# Altium project Zybo_Z7.PrjPcb (part 1 of 3)
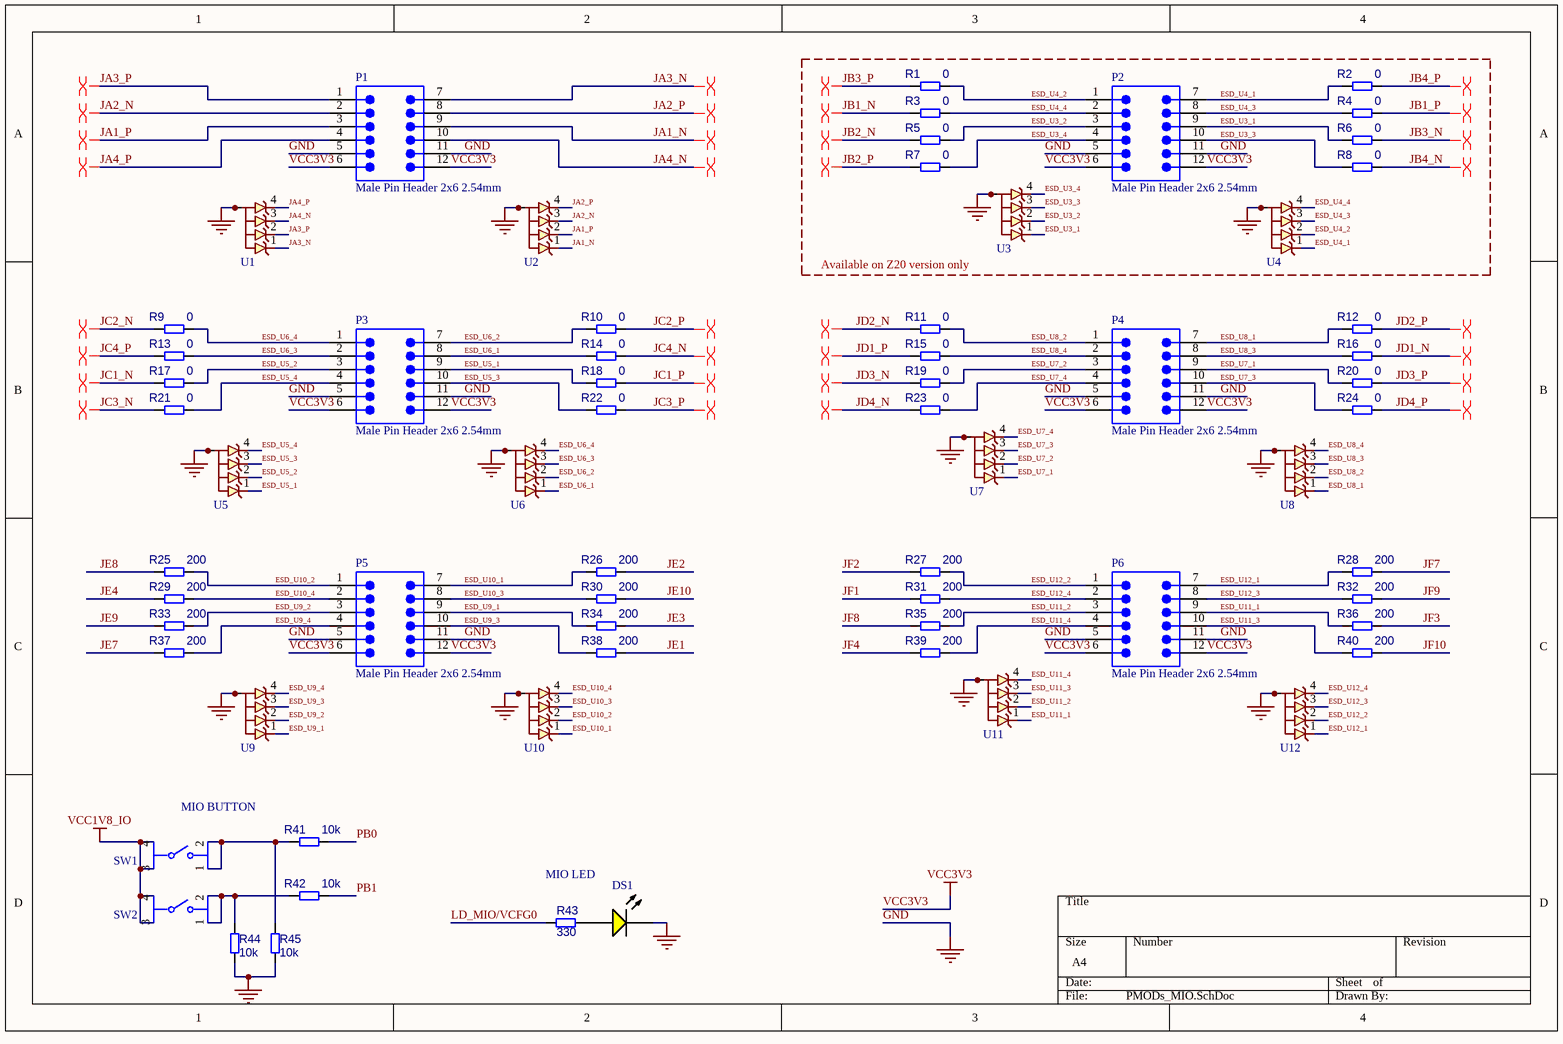
[diagram p0: PMODs_MIO.SchDoc]
13 sheets, 658 parts. Net scope: global (net labels, ports and power ports of the same name join across sheets).
Board file: Zybo_Z7_Pcb.PcbDoc
Sheets:
  PMODs_MIO.SchDoc
  MIPI_General_IO.SchDoc
  Ethernet_and_SD_Card.SchDoc
  Audio_Codec.SchDoc
  HDMI_Source.SchDoc
  HDMI_Sink.SchDoc
  USB_OTG.SchDoc
  FPGA_Config_Flash.SchDoc
  DDR_and_MIO_Banks.SchDoc
  FPGA_Banks_and_Filters.SchDoc
  FPGA_Power.SchDoc
  DDR3_Memory.SchDoc
  Power_Regulation.SchDoc

## Sheet PMODs_MIO.SchDoc
size A4; SheetNumber: 1; SheetTotal: 13

### Parts
DS1  19-217/Y5C-AM1N1VY/3T  [EVRL-0603-2_V]  (value not drawn)
P1  Male Pin Header 2x6 2.54mm  [Copy of Copy of Copy of 3M-2340-6111TG_V]
P2  Male Pin Header 2x6 2.54mm  [Copy of Copy of Copy of 3M-2340-6111TG_V]
P3  Male Pin Header 2x6 2.54mm  [Copy of Copy of Copy of 3M-2340-6111TG_V]
P4  Male Pin Header 2x6 2.54mm  [Copy of Copy of Copy of 3M-2340-6111TG_V]
P5  Male Pin Header 2x6 2.54mm  [Copy of Copy of Copy of 3M-2340-6111TG_V]
P6  Male Pin Header 2x6 2.54mm  [Copy of Copy of Copy of 3M-2340-6111TG_V]
R1  0  [R_0402]
R2  0  [R_0402]
R3  0  [R_0402]
R4  0  [R_0402]
R5  0  [R_0402]
R6  0  [R_0402]
R7  0  [R_0402]
R8  0  [R_0402]
R9  0  [R_0402]
R10  0  [R_0402]
R11  0  [R_0402]
R12  0  [R_0402]
R13  0  [R_0402]
R14  0  [R_0402]
R15  0  [R_0402]
R16  0  [R_0402]
R17  0  [R_0402]
R18  0  [R_0402]
R19  0  [R_0402]
R20  0  [R_0402]
R21  0  [R_0402]
R22  0  [R_0402]
R23  0  [R_0402]
R24  0  [R_0402]
R25  200  [R_0402]
R26  200  [R_0402]
R27  200  [R_0402]
R28  200  [R_0402]
R29  200  [R_0402]
R30  200  [R_0402]
R31  200  [R_0402]
R32  200  [R_0402]
R33  200  [R_0402]
R34  200  [R_0402]
R35  200  [R_0402]
R36  200  [R_0402]
R37  200  [R_0402]
R38  200  [R_0402]
R39  200  [R_0402]
R40  200  [R_0402]
R41  10k  [R_0402]
R42  10k  [R_0402]
R43  330  [R_0402]
R44  10k  [R_0402]
R45  10k  [R_0402]
SW1  1301.9316.24  [FP-1301_9316_24-MFG]  (value not drawn)
SW2  1301.9316.24  [FP-1301_9316_24-MFG]  (value not drawn)
U1  TVS0701DRBR  [FP-DRB0008A-MFG]  (value not drawn)
U2  TVS0701DRBR  [FP-DRB0008A-MFG]  (value not drawn)
U3  TVS0701DRBR  [FP-DRB0008A-MFG]  (value not drawn)
U4  TVS0701DRBR  [FP-DRB0008A-MFG]  (value not drawn)
U5  TVS0701DRBR  [FP-DRB0008A-MFG]  (value not drawn)
U6  TVS0701DRBR  [FP-DRB0008A-MFG]  (value not drawn)
U7  TVS0701DRBR  [FP-DRB0008A-MFG]  (value not drawn)
U8  TVS0701DRBR  [FP-DRB0008A-MFG]  (value not drawn)
U9  TVS0701DRBR  [FP-DRB0008A-MFG]  (value not drawn)
U10  TVS0701DRBR  [FP-DRB0008A-MFG]  (value not drawn)
U11  TVS0701DRBR  [FP-DRB0008A-MFG]  (value not drawn)
U12  TVS0701DRBR  [FP-DRB0008A-MFG]  (value not drawn)

### Blocks framed on the sheet
Available on Z20 version only: P2 R1-R8 U3 U4

### Nets
GND: DS1.2(K) P1.5 P1.11 P2.5 P2.11 P3.5 P3.11 P4.5 P4.11 P5.5 P5.11 P6.5 P6.11 R44.1 R45.1 U1.5(GND) U1.6(GND) U1.7(GND) U1.8(GND) U1.9(Thermal_Pad) U2.5(GND) U2.6(GND) U2.7(GND) U2.8(GND) U2.9(Thermal_Pad) U3.5(GND) U3.6(GND) U3.7(GND) U3.8(GND) U3.9(Thermal_Pad) U4.5(GND) U4.6(GND) U4.7(GND) U4.8(GND) U4.9(Thermal_Pad) U5.5(GND) U5.6(GND) U5.7(GND) U5.8(GND) U5.9(Thermal_Pad) U6.5(GND) U6.6(GND) U6.7(GND) U6.8(GND) U6.9(Thermal_Pad) U7.5(GND) U7.6(GND) U7.7(GND) U7.8(GND) U7.9(Thermal_Pad) U8.5(GND) U8.6(GND) U8.7(GND) U8.8(GND) U8.9(Thermal_Pad) U9.5(GND) U9.6(GND) U9.7(GND) U9.8(GND) U9.9(Thermal_Pad) U10.5(GND) U10.6(GND) U10.7(GND) U10.8(GND) U10.9(Thermal_Pad) U11.5(GND) U11.6(GND) U11.7(GND) U11.8(GND) U11.9(Thermal_Pad) U12.5(GND) U12.6(GND) U12.7(GND) U12.8(GND) U12.9(Thermal_Pad)
VCC1V8_IO: SW1.3 SW1.4 SW2.3 SW2.4
VCC3V3: P1.6 P1.12 P2.6 P2.12 P3.6 P3.12 P4.6 P4.12 P5.6 P5.12 P6.6 P6.12
ESD_U3_1: P2.9 R6.1 U3.1(IN)
ESD_U3_2: P2.3 R5.2 U3.2(IN)
ESD_U3_3: P2.10 R8.1 U3.3(IN)
ESD_U3_4: P2.4 R7.2 U3.4(IN)
ESD_U4_1: P2.7 R2.1 U4.1(IN)
ESD_U4_2: P2.1 R1.2 U4.2(IN)
ESD_U4_3: P2.8 R4.1 U4.3(IN)
ESD_U4_4: P2.2 R3.2 U4.4(IN)
ESD_U5_1: P3.9 R18.1 U5.1(IN)
ESD_U5_2: P3.3 R17.2 U5.2(IN)
ESD_U5_3: P3.10 R22.1 U5.3(IN)
ESD_U5_4: P3.4 R21.2 U5.4(IN)
ESD_U6_1: P3.8 R14.1 U6.1(IN)
ESD_U6_2: P3.7 R10.1 U6.2(IN)
ESD_U6_3: P3.2 R13.2 U6.3(IN)
ESD_U6_4: P3.1 R9.2 U6.4(IN)
ESD_U7_1: P4.9 R20.1 U7.1(IN)
ESD_U7_2: P4.3 R19.2 U7.2(IN)
ESD_U7_3: P4.10 R24.1 U7.3(IN)
ESD_U7_4: P4.4 R23.2 U7.4(IN)
ESD_U8_1: P4.7 R12.1 U8.1(IN)
ESD_U8_2: P4.1 R11.2 U8.2(IN)
ESD_U8_3: P4.8 R16.1 U8.3(IN)
ESD_U8_4: P4.2 R15.2 U8.4(IN)
ESD_U9_1: P5.9 R34.1 U9.1(IN)
ESD_U9_2: P5.3 R33.2 U9.2(IN)
ESD_U9_3: P5.10 R38.1 U9.3(IN)
ESD_U9_4: P5.4 R37.2 U9.4(IN)
ESD_U10_1: P5.7 R26.1 U10.1(IN)
ESD_U10_2: P5.1 R25.2 U10.2(IN)
ESD_U10_3: P5.8 R30.1 U10.3(IN)
ESD_U10_4: P5.2 R29.2 U10.4(IN)
ESD_U11_1: P6.9 R36.1 U11.1(IN)
ESD_U11_2: P6.3 R35.2 U11.2(IN)
ESD_U11_3: P6.10 R40.1 U11.3(IN)
ESD_U11_4: P6.4 R39.2 U11.4(IN)
ESD_U12_1: P6.7 R28.1 U12.1(IN)
ESD_U12_2: P6.1 R27.2 U12.2(IN)
ESD_U12_3: P6.8 R32.1 U12.3(IN)
ESD_U12_4: P6.2 R31.2 U12.4(IN)
JA1_N: P1.9 U2.1(IN)
JA1_P: P1.3 U2.2(IN)
JA2_N: P1.2 U2.3(IN)
JA2_P: P1.8 U2.4(IN)
JA3_N: P1.7 U1.1(IN)
JA3_P: P1.1 U1.2(IN)
JA4_N: P1.10 U1.3(IN)
JA4_P: P1.4 U1.4(IN)
JB1_N: R3.1
JB1_P: R4.2
JB2_N: R5.1
JB2_P: R7.1
JB3_N: R6.2
JB3_P: R1.1
JB4_N: R8.2
JB4_P: R2.2
JC1_N: R17.1
JC1_P: R18.2
JC2_N: R9.1
JC2_P: R10.2
JC3_N: R21.1
JC3_P: R22.2
JC4_N: R14.2
JC4_P: R13.1
JD1_N: R16.2
JD1_P: R15.1
JD2_N: R11.1
JD2_P: R12.2
JD3_N: R19.1
JD3_P: R20.2
JD4_N: R23.1
JD4_P: R24.2
JE1: R38.2
JE2: R26.2
JE3: R34.2
JE4: R29.1
JE7: R37.1
JE8: R25.1
JE9: R33.1
JE10: R30.2
JF1: R31.1
JF2: R27.1
JF3: R36.2
JF4: R39.1
JF7: R28.2
JF8: R35.1
JF9: R32.2
JF10: R40.2
LD_MIO/VCFG0: R43.2
PB0: R41.2
PB1: R42.2
NetDS1_1: DS1.1(A) R43.1
NetR41_1: R41.1 R45.2 SW1.1 SW1.2
NetR42_1: R42.1 R44.2 SW2.1 SW2.2

### Layout directives
differential pair: JA1_N, JA1_P, JA2_N, JA2_P, JA3_N, JA3_P, JA4_N, JA4_P, JB1_N, JB1_P, JB2_N, JB2_P, JB3_N, JB3_P, JB4_N, JB4_P, JC1_N, JC1_P, JC2_N, JC2_P, JC3_N, JC3_P, JC4_N, JC4_P, JD1_N, JD1_P, JD2_N, JD2_P, JD3_N, JD3_P, JD4_N, JD4_P

### Notes on the sheet
- (near SW1) MIO BUTTON
- MIO LED

### Library data of the parts
DS1 = CMP-007-00005-2: Chip LED, Yellow, 5 V, 25mA, -40 to 85 degC, 2-Pin SMD (0603), RoHS, Tape and Reel; Manufacturer: Everlight Electronics; Datasheet Version: Rev. 1.0, 12/2005; Package Reference: 0603; Mounting Technology: SM; Package Description: 2-Pin Surface Mount Device, Body 1.6 x 0.8 mm; Case/Package: 0603; Datasheet URL: http://www.fairchip.com/pdf/Everlight/19-217-Y5C-AM1N1VY-3T.pdf; Manufacturer URL: http://www.everlight.com/; RoHS Compliant: False
P1-P6 = CMP-002-00077-1: Male Header, Pitch 2.54 mm, 2x6 Position, Height 8.636 mm, Tail Length 3.05 mm, -55 to 105 degC, RoHS, Bulk; Manufacturer: 3M; Current Rating: 3A; Rows: 1; Pins: 40; Case/Package: 2340-6111TG; Package Description: Male Header, Pitch 2.54 mm, 1 x 40 Position, Height 8.636 mm, Tail Length 3.05 mm; Mounting Technology: TH; Lead Pitch: 0.1inch; Contact Finish: Gold; Connector Type: Header; Manufacturer URL: http://www.3m.com/; Gender: Male; Min Operating Temperature: -55°C; Datasheet Version: Aug-08; Contact Plating: Gold; Packaging: Bulk; Package Reference: 2340-6111TG; Colour: Black; Max Current Rating: 3A; RoHS Compliant: True; Max Operating Temperature: 105°C; Package Quantity: 200; Datasheet URL: https://datasheet.ciiva.com/5161/ts0766-242217-5161112.pdf; Contact Material: Copper
R1-R45 = CMP-009-00178-3: Chip 0402 resistor
SW1 SW2 = CMP-00030-00001-1: Switch Tactile N.O. SPST Round Button Gull Wing 0.05A 12VDC >100000Cycles 1.6N SMD T/R; Max Operating Temperature: 70°C; Case/Package: SMD/SMT; Mounting Technology: Surface Mount; Min Operating Temperature: -20°C
U1-U12 = CMP-031-00006-4: 7-V bidirectional flat-clamp surge protection device 8-SON -40 to 125; Min Operating Temperature: -40°C; Pins: 8; Max Operating Temperature: 125°C

## Sheet MIPI_General_IO.SchDoc
size A4; SheetNumber: 2; SheetTotal: 13
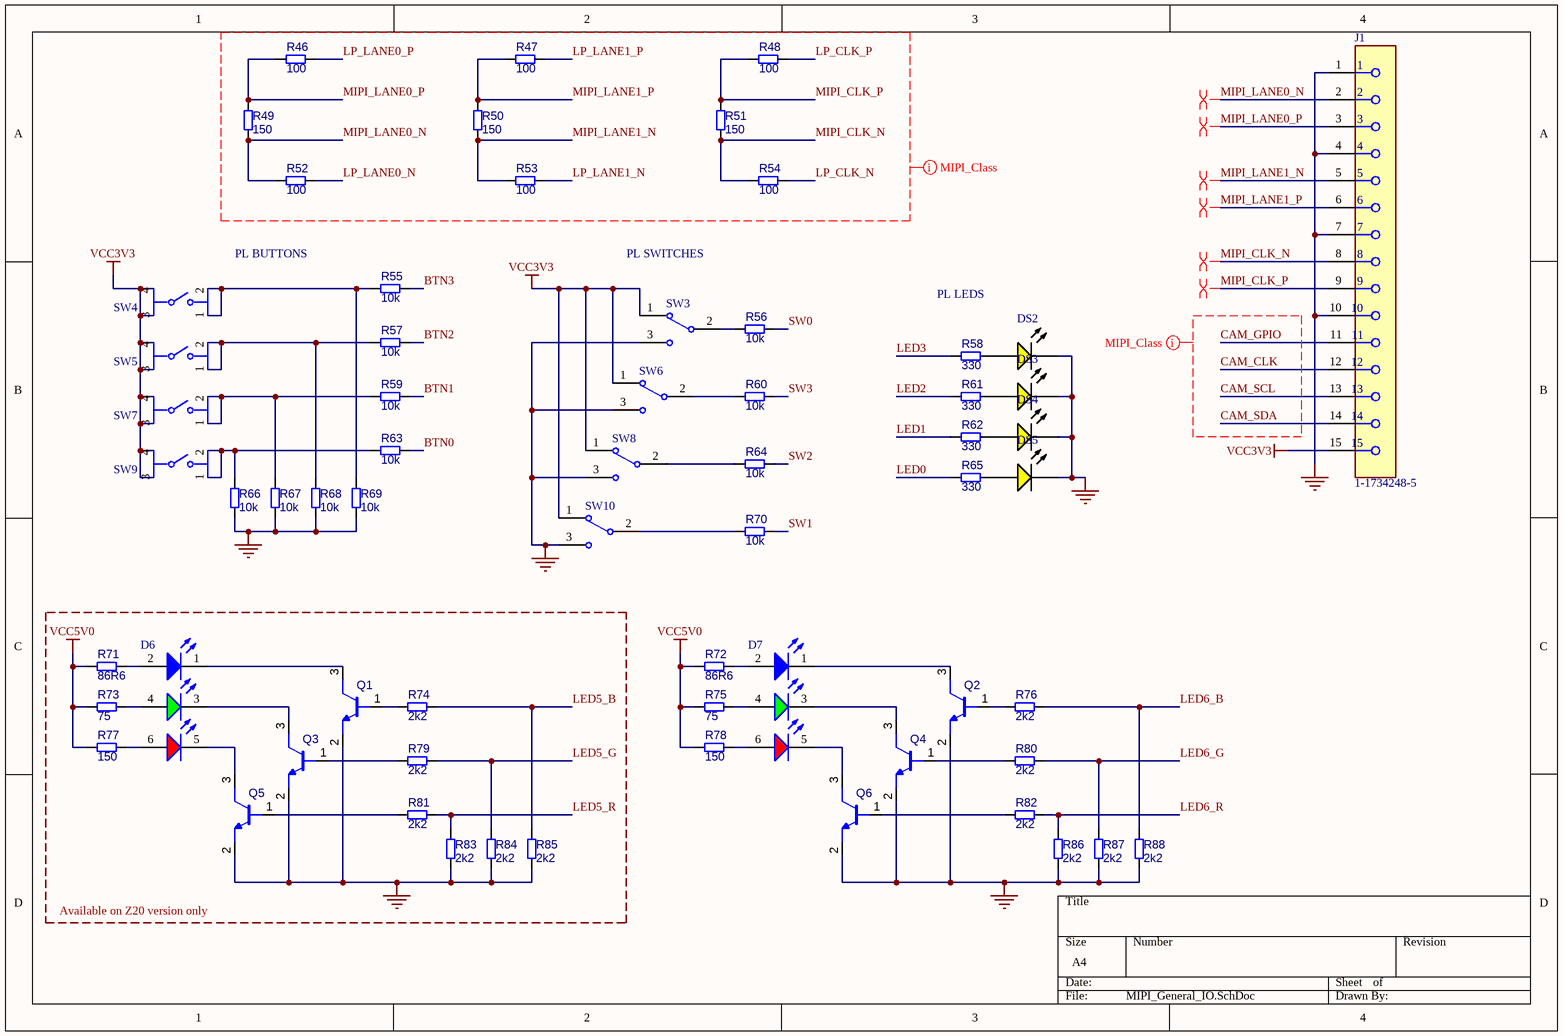
[diagram p1: MIPI_General_IO.SchDoc]

### Parts
D6  150352M173303  [WL-SFTW_3528_150352M173303]  (value not drawn)
D7  150352M173303  [WL-SFTW_3528_150352M173303]  (value not drawn)
DS2  19-217/Y5C-AM1N1VY/3T  [EVRL-0603-2_V]  (value not drawn)
DS3  19-217/Y5C-AM1N1VY/3T  [EVRL-0603-2_V]  (value not drawn)
DS4  19-217/Y5C-AM1N1VY/3T  [EVRL-0603-2_V]  (value not drawn)
DS5  19-217/Y5C-AM1N1VY/3T  [EVRL-0603-2_V]  (value not drawn)
J1  1-1734248-5  [FP-1-1734248-5-MFG]
Q1  MMBT2222AM3T5G  [ROHM-SOT723-3_V]  (value not drawn)
Q2  MMBT2222AM3T5G  [ROHM-SOT723-3_V]  (value not drawn)
Q3  MMBT2222AM3T5G  [ROHM-SOT723-3_V]  (value not drawn)
Q4  MMBT2222AM3T5G  [ROHM-SOT723-3_V]  (value not drawn)
Q5  MMBT2222AM3T5G  [ROHM-SOT723-3_V]  (value not drawn)
Q6  MMBT2222AM3T5G  [ROHM-SOT723-3_V]  (value not drawn)
R46  100  [R_0402]
R47  100  [R_0402]
R48  100  [R_0402]
R49  150  [R_0402]
R50  150  [R_0402]
R51  150  [R_0402]
R52  100  [R_0402]
R53  100  [R_0402]
R54  100  [R_0402]
R55  10k  [R_0402]
R56  10k  [R_0402]
R57  10k  [R_0402]
R58  330  [R_0402]
R59  10k  [R_0402]
R60  10k  [R_0402]
R61  330  [R_0402]
R62  330  [R_0402]
R63  10k  [R_0402]
R64  10k  [R_0402]
R65  330  [R_0402]
R66  10k  [R_0402]
R67  10k  [R_0402]
R68  10k  [R_0402]
R69  10k  [R_0402]
R70  10k  [R_0402]
R71  86R6  [R_0402]
R72  86R6  [R_0402]
R73  75  [R_0402]
R74  2k2  [R_0402]
R75  75  [R_0402]
R76  2k2  [R_0402]
R77  150  [R_0402]
R78  150  [R_0402]
R79  2k2  [R_0402]
R80  2k2  [R_0402]
R81  2k2  [R_0402]
R82  2k2  [R_0402]
R83  2k2  [R_0402]
R84  2k2  [R_0402]
R85  2k2  [R_0402]
R86  2k2  [R_0402]
R87  2k2  [R_0402]
R88  2k2  [R_0402]
SW3  EG1218  [ESWI-EG1218_V]  (value not drawn)
SW4  1301.9316.24  [FP-1301_9316_24-MFG]  (value not drawn)
SW5  1301.9316.24  [FP-1301_9316_24-MFG]  (value not drawn)
SW6  EG1218  [ESWI-EG1218_V]  (value not drawn)
SW7  1301.9316.24  [FP-1301_9316_24-MFG]  (value not drawn)
SW8  EG1218  [ESWI-EG1218_V]  (value not drawn)
SW9  1301.9316.24  [FP-1301_9316_24-MFG]  (value not drawn)
SW10  EG1218  [ESWI-EG1218_V]  (value not drawn)

### Blocks framed on the sheet
Available on Z20 version only: D6 Q1 Q3 Q5 R71 R73 R74 R77 R79 R81 R83-R85

### Nets
GND: DS2.2(K) DS3.2(K) DS4.2(K) DS5.2(K) J1.1 J1.4 J1.7 J1.10 Q1.2(E) Q2.2(E) Q3.2(E) Q4.2(E) Q5.2(E) Q6.2(E) R66.2 R67.2 R68.2 R69.2 R83.1 R84.1 R85.1 R86.1 R87.1 R88.1 SW3.3 SW6.3 SW8.3 SW10.3
VCC3V3: J1.15 SW3.1 SW4.3 SW4.4 SW5.3 SW5.4 SW6.1 SW7.3 SW7.4 SW8.1 SW9.3 SW9.4 SW10.1
VCC5V0: R71.1 R72.1 R73.1 R75.1 R77.1 R78.1
BTN0: R63.1
BTN1: R59.1
BTN2: R57.1
BTN3: R55.1
CAM_CLK: J1.12
CAM_GPIO: J1.11
CAM_SCL: J1.13
CAM_SDA: J1.14
LED0: R65.2
LED1: R62.2
LED2: R61.2
LED3: R58.2
LED5_B: R74.2 R85.2
LED5_G: R79.2 R84.2
LED5_R: R81.2 R83.2
LED6_B: R76.2 R88.2
LED6_G: R80.2 R87.2
LED6_R: R82.2 R86.2
LP_CLK_N: R54.1
LP_CLK_P: R48.1
LP_LANE0_N: R52.1
LP_LANE0_P: R46.1
LP_LANE1_N: R53.1
LP_LANE1_P: R47.1
MIPI_CLK_N: J1.8 R51.2 R54.2
MIPI_CLK_P: J1.9 R48.2 R51.1
MIPI_LANE0_N: J1.2 R49.2 R52.2
MIPI_LANE0_P: J1.3 R46.2 R49.1
MIPI_LANE1_N: J1.5 R50.2 R53.2
MIPI_LANE1_P: J1.6 R47.2 R50.1
SW0: R56.1
SW1: R70.1
SW2: R64.1
SW3: R60.1
NetD6_1: D6.1(K) Q1.3(C)
NetD6_2: D6.2(A) R71.2
NetD6_3: D6.3(K) Q3.3(C)
NetD6_4: D6.4(A) R73.2
NetD6_5: D6.5(K) Q5.3(C)
NetD6_6: D6.6(A) R77.2
NetD7_1: D7.1(K) Q2.3(C)
NetD7_2: D7.2(A) R72.2
NetD7_3: D7.3(K) Q4.3(C)
NetD7_4: D7.4(A) R75.2
NetD7_5: D7.5(K) Q6.3(C)
NetD7_6: D7.6(A) R78.2
NetDS2_1: DS2.1(A) R58.1
NetDS3_1: DS3.1(A) R61.1
NetDS4_1: DS4.1(A) R62.1
NetDS5_1: DS5.1(A) R65.1
NetQ1_1: Q1.1(B) R74.1
NetQ2_1: Q2.1(B) R76.1
NetQ3_1: Q3.1(B) R79.1
NetQ4_1: Q4.1(B) R80.1
NetQ5_1: Q5.1(B) R81.1
NetQ6_1: Q6.1(B) R82.1
NetR55_2: R55.2 R69.1 SW4.1 SW4.2
NetR56_2: R56.2 SW3.2(COM)
NetR57_2: R57.2 R68.1 SW5.1 SW5.2
NetR59_2: R59.2 R67.1 SW7.1 SW7.2
NetR60_2: R60.2 SW6.2(COM)
NetR63_2: R63.2 R66.1 SW9.1 SW9.2
NetR64_2: R64.2 SW8.2(COM)
NetR70_2: R70.2 SW10.2(COM)

### Layout directives
differential pair: MIPI_CLK_N, MIPI_CLK_P, MIPI_LANE0_N, MIPI_LANE0_P, MIPI_LANE1_N, MIPI_LANE1_P
net class MIPI_Class: CAM_CLK, CAM_GPIO, CAM_SCL, CAM_SDA, LP_CLK_N, LP_CLK_P, LP_LANE0_N, LP_LANE0_P, LP_LANE1_N, LP_LANE1_P, MIPI_CLK_N, MIPI_CLK_P, MIPI_LANE0_N, MIPI_LANE0_P, MIPI_LANE1_N, MIPI_LANE1_P

### Notes on the sheet
- PL BUTTONS
- PL SWITCHES
- PL LEDS

### Library data of the parts
D6 D7 = CMP-03913-162511587-1: Led, Rgb, 625/520/470Nm, 120Deg Rohs Compliant: Yes; Manufacturer Lifecycle Status: NEW; Luminous Intensity: 500mcd; Peak Wavelength: 465nm; YEOL: 1 = Estimated lifetime > 10 years; Dominant Wavelength: 520nm; Forward Voltage: 2V; Forward Current: 100mA; Viewing Angle: 120°; Max Reverse Voltage (DC): 5V; Power Dissipation: 65mW; Lifecycle Status: New; Max Operating Temperature: 105°C; Min Operating Temperature: -40°C; RoHS: Compliant
DS2-DS5 = CMP-007-00005-2: as DS1 on sheet PMODs_MIO; Datasheet Version: Rev. 1.0, 12/2005; Package Reference: 0603; Mounting Technology: SM; Package Description: 2-Pin Surface Mount Device, Body 1.6 x 0.8 mm; Case/Package: 0603; Datasheet URL: http://www.fairchip.com/pdf/Everlight/19-217-Y5C-AM1N1VY-3T.pdf; Manufacturer URL: http://www.everlight.com/; RoHS Compliant: False
J1 = CMP-03368-000001-1: CONN FPC VERT 15POS 1.00MM SMD; Manufacturer: TE; Conn Orientation: Vertical; Conn Gender: Female; Current Rating: 1A; Is Female: yes; Number Of Contacts: 15; Pitch: 1mm; Voltage Rating: 125V; ComponentLink2URL: https://www.te.com/commerce/DocumentDelivery/DDEController?Action=showdoc&DocId=Customer+Drawing%7F1734248%7FE1%7Fpdf%7FEnglish%7FENG_CD_1734248_E1__.pdf%7F1-1734248-5; Device Class L1: Connectors; Category: Conn; Package: 0; Lead Free: Yes; Digikey Description: CONN FPC VERT 15POS 1.00MM SMD; Height: 8mm; Manufacturer Part Number: 1-1734248-5; Temperature: -20°C to +85°C; Contact Material: Gold,Nickel; Device Class L3: unset; ComponentLink2Description: Datasheet; RoHS: TRUE; Temperature Range Low: -20°C; Octopart: https://octopart.com/1-1734248-5-te+connectivity-40620898; Device Class L2: FFC / FPC; Mouser Description: FFC & FPC Connectors 15P 1.0 FPC, Zip V/T SMT; Automotive: No; Temperature Range High: +85°C; Mounting Type: Surface Mount
Q1-Q6 = CMP-013-00028-2: NPN General Purpose Transistor, 3-Pin SOT-723, Pb-Free, Tape and Reel; ComponentLink3Description: Package Specification; ComponentLink1URL: http://www.onsemi.com/; ComponentLink3URL: http://www.onsemi.com/pub_link/Collateral/631AA.PDF; ComponentLink2Description: Datasheet; Mounting Technology: SMT; Pins: 3; Case/Package: SOT-723; RoHS Compliant: TRUE; ComponentLink1Description: Manufacturer URL; ComponentLink2URL: http://www.onsemi.cn/pub_link/Collateral/MMBT2222AM3-D.PDF
R46-R88 = CMP-009-00178-3: Chip 0402 resistor
SW3 SW6 SW8 SW10 = CMP-011-00006-2: Slide Switch, SPDT, 500 V, -20 to 70 degC, 3-Pin THD, RoHS, Bulk; Manufacturer: E-Switch; Voltage Rating (DC): 30V; Current Rating: 200mA; Operating Force: 250gf; Package Quantity: 1000; Contact Plating: Silver; Max Operating Temperature: 70°C; Min Operating Temperature: -20°C; Contact Material: Copper; Datasheet URL: https://www.e-switch.com/system/asset/product_line/data_sheet/119/EG.pdf; Contact Finish: Silver; Case/Package: EG1218; Voltage Rating (AC): 30V; Datasheet Version: Oct-15; Package Description: 3-Pin Through Hole Device, Body 11.6 x 4 mm, Pitch 2.5 mm; RoHS Compliant: True; Package Reference: EG1218; Manufacturer URL: http://www.e-switch.ch/en/; Throw Configuration: SPDT; Contact Current Rating: 200mA; Mounting Technology: TH; Packaging: Bulk; Pins: 3
SW4 SW5 SW7 SW9 = CMP-00030-00001-1: as SW1 on sheet PMODs_MIO; Max Operating Temperature: 70°C; Case/Package: SMD/SMT; Mounting Technology: Surface Mount; Min Operating Temperature: -20°C

## Sheet Ethernet_and_SD_Card.SchDoc
size A4; SheetNumber: 3; SheetTotal: 13
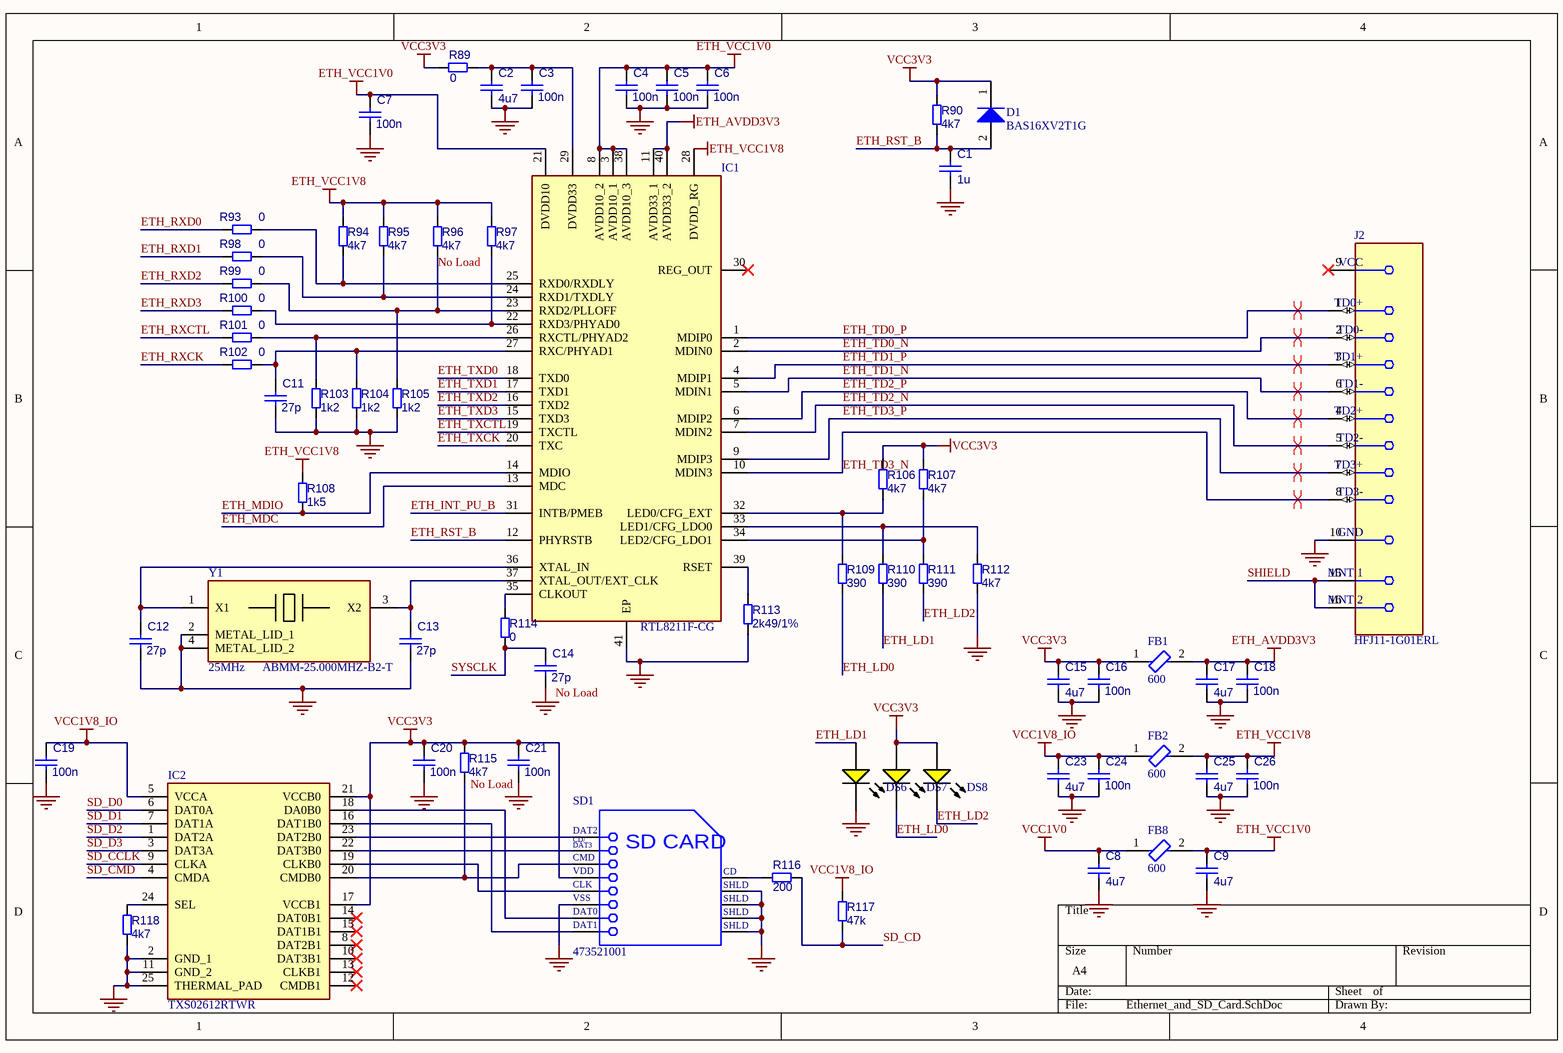
[diagram p2: Ethernet_and_SD_Card.SchDoc]

### Parts
C1  1u  [C_0805]
C2  4u7  [C_0805]
C3  100n  [CAPC1005X50N_0402]
C4  100n  [CAPC1005X50N_0402]
C5  100n  [CAPC1005X50N_0402]
C6  100n  [CAPC1005X50N_0402]
C7  100n  [CAPC1005X50N_0402]
C8  4u7  [C_0805]
C9  4u7  [C_0805]
C11  27p  [CAPC1005X50N_0402]
C12  27p  [CAPC1005X50N_0402]
C13  27p  [CAPC1005X50N_0402]
C14  27p  [CAPC1005X50N_0402]
C15  4u7  [C_0805]
C16  100n  [CAPC1005X50N_0402]
C17  4u7  [C_0805]
C18  100n  [CAPC1005X50N_0402]
C19  100n  [CAPC1005X50N_0402]
C20  100n  [CAPC1005X50N_0402]
C21  100n  [CAPC1005X50N_0402]
C23  4u7  [C_0805]
C24  100n  [CAPC1005X50N_0402]
C25  4u7  [C_0805]
C26  100n  [CAPC1005X50N_0402]
D1  BAS16XV2T1G  [ONSC-SOD-523-2-502-01_V]
DS6  19-217/Y5C-AM1N1VY/3T  [EVRL-0603-2_V]  (value not drawn)
DS7  19-217/Y5C-AM1N1VY/3T  [EVRL-0603-2_V]  (value not drawn)
DS8  19-217/Y5C-AM1N1VY/3T  [EVRL-0603-2_V]  (value not drawn)
FB1  600  [FP-BLM31-0_2-t1_6-IPC_A]
FB2  600  [FP-BLM31-0_2-t1_6-IPC_A]
FB8  600  [FP-BLM31-0_2-t1_6-IPC_A]
IC1  RTL8211F-CG  [QFN40P500X500X90-41N-D]
IC2  TXS02612RTWR  [QFN50P400X400X80-25N-D]
J2  HFJ11-1G01ERL  [FP-HFJ11-1G01ERL-MFG]
R89  0  [R_0402]
R90  4k7  [R_0402]
R93  0  [R_0402]
R94  4k7  [R_0402]
R95  4k7  [R_0402]
R96  4k7  [R_0402]
R97  4k7  [R_0402]
R98  0  [R_0402]
R99  0  [R_0402]
R100  0  [R_0402]
R101  0  [R_0402]
R102  0  [R_0402]
R103  1k2  [R_0402]
R104  1k2  [R_0402]
R105  1k2  [R_0402]
R106  4k7  [R_0402]
R107  4k7  [R_0402]
R108  1k5  [R_0402]
R109  390  [R_0402]
R110  390  [R_0402]
R111  390  [R_0402]
R112  4k7  [R_0402]
R113  2k49/1%  [R_0402]
R114  0  [R_0402]
R115  4k7  [R_0402]
R116  200  [R_0402]
R117  47k  [R_0402]
R118  4k7  [R_0402]
SD1  473521001  [MOLX-473521001_V]
Y1  25MHz  [ABMM25000MHZB2T]

### Nets
ETH_AVDD3V3: C17.2 C18.2 FB1.2 IC1.11(AVDD33_1) IC1.40(AVDD33_2)
ETH_VCC1V0: C4.2 C5.2 C6.2 C7.2 C9.2 FB8.2 IC1.3(AVDD10_1) IC1.8(AVDD10_2) IC1.21(DVDD10) IC1.38(AVDD10_3)
ETH_VCC1V8: C25.2 C26.2 FB2.2 IC1.28(DVDD_RG) R94.2 R95.2 R96.2 R97.2 R108.2
GND: C1.1 C2.1 C3.1 C4.1 C5.1 C6.1 C7.1 C8.1 C9.1 C11.1 C12.1 C13.1 C14.1 C15.1 C16.1 C17.1 C18.1 C19.1 C20.1 C21.1 C23.1 C24.1 C25.1 C26.1 DS6.2(K) IC1.41(EP) IC2.2(GND_1) IC2.11(GND_2) IC2.25(THERMAL_PAD) J2.10(GND) R103.1 R104.1 R105.1 R112.2 R113.2 R118.1 SD1.6(VSS) SD1.10(SHLD) SD1.11(SHLD) SD1.12(SHLD) SD1.13(SHLD) Y1.2(METAL_LID_1) Y1.4(METAL_LID_2)
VCC1V0: C8.2 FB8.1
VCC1V8_IO: C19.2 C23.2 C24.2 FB2.1 IC2.5(VCCA) R117.2
VCC3V3: C15.2 C16.2 C20.2 C21.2 D1.1(K) DS7.1(A) DS8.1(A) FB1.1 IC2.17(VCCB1) IC2.21(VCCB0) R89.1 R90.2 R106.1 R107.1 R115.1 SD1.4(VDD)
ETH_INT_PU_B: IC1.31(INTB/PMEB)
ETH_LD0: DS7.2(K) R109.2
ETH_LD1: DS6.1(A) R110.2
ETH_LD2: DS8.2(K) R111.2
ETH_MDC: IC1.13(MDC)
ETH_MDIO: IC1.14(MDIO) R108.1
ETH_RST_B: C1.2 D1.2(A) IC1.12(PHYRSTB) R90.1
ETH_RXCK: R102.1
ETH_RXCTL: R101.1
ETH_RXD0: R93.1
ETH_RXD1: R98.1
ETH_RXD2: R99.1
ETH_RXD3: R100.1
ETH_TD0_N: IC1.2(MDIN0) J2.2(TD0-)
ETH_TD0_P: IC1.1(MDIP0) J2.1(TD0+)
ETH_TD1_N: IC1.5(MDIN1) J2.6(TD1-)
ETH_TD1_P: IC1.4(MDIP1) J2.3(TD1+)
ETH_TD2_N: IC1.7(MDIN2) J2.5(TD2-)
ETH_TD2_P: IC1.6(MDIP2) J2.4(TD2+)
ETH_TD3_N: IC1.10(MDIN3) J2.8(TD3-)
ETH_TD3_P: IC1.9(MDIP3) J2.7(TD3+)
ETH_TXCK: IC1.20(TXC)
ETH_TXCTL: IC1.19(TXCTL)
ETH_TXD0: IC1.18(TXD0)
ETH_TXD1: IC1.17(TXD1)
ETH_TXD2: IC1.16(TXD2)
ETH_TXD3: IC1.15(TXD3)
SD_CCLK: IC2.9(CLKA)
SD_CD: R116.2 R117.1
SD_CMD: IC2.4(CMDA)
SD_D0: IC2.6(DAT0A)
SD_D1: IC2.7(DAT1A)
SD_D2: IC2.1(DAT2A)
SD_D3: IC2.3(DAT3A)
SHIELD: J2.15(MNT_1) J2.16(MNT_2)
SYSCLK: C14.2 R114.2
NetC2_2: C2.2 C3.2 IC1.29(DVDD33) R89.2
NetC11_2: C11.2 IC1.27(RXC/PHYAD1) R102.2 R104.2
NetC12_2: C12.2 IC1.36(XTAL_IN) Y1.1(X1)
NetC13_2: C13.2 IC1.37(XTAL_OUT/EXT_CLK) Y1.3(X2)
NetIC1_22: IC1.22(RXD3/PHYAD0) R97.1 R100.2
NetIC1_23: IC1.23(RXD2/PLLOFF) R96.1 R99.2 R105.2
NetIC1_24: IC1.24(RXD1/TXDLY) R95.1 R98.2
NetIC1_25: IC1.25(RXD0/RXDLY) R93.2 R94.1
NetIC1_26: IC1.26(RXCTL/PHYAD2) R101.2 R103.2
NetIC1_32: IC1.32(LED0/CFG_EXT) R106.2 R109.1
NetIC1_33: IC1.33(LED1/CFG_LDO0) R110.1 R112.1
NetIC1_34: IC1.34(LED2/CFG_LDO1) R107.2 R111.1
NetIC1_35: IC1.35(CLKOUT) R114.1
NetIC1_39: IC1.39(RSET) R113.1
NetIC2_16: IC2.16(DAT1B0) SD1.8(DAT1)
NetIC2_18: IC2.18(DA0B0) SD1.7(DAT0)
NetIC2_19: IC2.19(CLKB0) SD1.5(CLK)
NetIC2_20: IC2.20(CMDB0) R115.2 SD1.3(CMD)
NetIC2_22: IC2.22(DAT3B0) SD1.2(CD/DAT3)
NetIC2_23: IC2.23(DAT2B0) SD1.1(DAT2)
NetIC2_24: IC2.24(SEL) R118.2
NetR116_1: R116.1 SD1.9(CD)

Not connected (* = marked no-connect by the designer): IC1 30(REG_OUT)*; IC2 8(DAT2B1)* 10(DAT3B1)* 12(CMDB1)* 13(CLKB1)* 14(DAT0B1)* 15(DAT1B1)*; J2 9(VCC)*

### Layout directives
differential pair: ETH_TD0_N, ETH_TD0_P, ETH_TD1_N, ETH_TD1_P, ETH_TD2_N, ETH_TD2_P, ETH_TD3_N, ETH_TD3_P

### Notes on the sheet
- No Load
- (near Y1) ABMM-25.000MHZ-B2-T
- (near C14) No Load
- (in symbol CMP-2000-05848-1) CD/; DAT3; SD CARD

### Library data of the parts
C1 C2 C8 C9 C15 C17 C23 C25 = CMP-001-00086-2: MLCC 0805
C3-C7 C11-C14 C16 C18-C21 C24 C26 = CMP-001-00084-2: MLCC 0402
D1 = CMP-1054-00076-1: Switching Diode, 2-Pin SOD-523, Pb-Free, Tape and Reel; Manufacturer: On Semiconductor; trr Max (ns): 6; Configuration: Single; IF Max (A): 0.2; ComponentLink1URL: http://www.onsemi.com/; DatasheetVersion: Rev. 7; RoHS: TRUE; PackageVersion: Rev. E, 09/2010; Packing: Tape and Reel; ComponentLink2Description: Datasheet; ComponentLink2URL: http://www.onsemi.com/pub_link/Collateral/BAS16XV2T1-D.PDF; ComponentLink3Description: Package Specification; PackageReference: SOD-523-2-502-01; ComponentLink1Description: Manufacturer URL; PartNumber: BAS16XV2T1G; Mounting Technology: Surface Mount; PackageDescription: 2-Pin SOD, Body 1.2 x 0.8 mm; ComponentLink3URL: http://www.onsemi.com/pub_link/Collateral/502-01.PDF
DS6-DS8 = CMP-007-00005-2: as DS1 on sheet PMODs_MIO; Datasheet Version: Rev. 1.0, 12/2005; Package Reference: 0603; Mounting Technology: SM; Package Description: 2-Pin Surface Mount Device, Body 1.6 x 0.8 mm; Case/Package: 0603; Datasheet URL: http://www.fairchip.com/pdf/Everlight/19-217-Y5C-AM1N1VY-3T.pdf; Manufacturer URL: http://www.everlight.com/; RoHS Compliant: False
FB1 FB2 FB8 = CMP-06046-002432-1: Chip Ferrite Bead, 1206, 600Ω @ 100MHz, 0.038Ω, 25%, 2.9A; Number of Lines: 1; DC Resistance (DCR): 38mR; Max Operating Temperature: 125°C; Packaging: Cut Tape; Min Operating Temperature: -55°C; Mount: Surface Mount; Case Code (Metric): 3216; Case/Package: 1206; Case Code (Imperial): 1206; Max Current Rating: 2.9A
IC1 = RTL8211F-CG: Integrated Circuit; Manufacturer_Name: Realtek; Height: 0.9mm; Manufacturer_Part_Number: RTL8211F-CG
IC2 = TXS02612RTWR: Integrated Circuit; Manufacturer_Name: Texas Instruments; Datasheet Link: http://www.ti.com/lit/gpn/txs02612; Height: 0.8mm; Manufacturer_Part_Number: TXS02612RTWR; Mouser Part Number: 595-TXS02612RTWR; Mouser Price/Stock: https://www.mouser.co.uk/ProductDetail/Texas-Instruments/TXS02612RTWR?qs=dqESbKqT1jaNFKC1R4M7hw%3D%3D; Arrow Part Number: TXS02612RTWR; Arrow Price/Stock: https://www.arrow.com/en/products/txs02612rtwr/texas-instruments?utm_currency=USD&region=nac
J2 = CMP-218039-000001-2: Conn RJ-45 F 8 POS 2.54mm Solder RA Thru-Hole 10 Terminal 1 Port; Manufacturer: HALO; Pitch: 1.27mm; Number Of Contacts: 8; Shielding: true; Conn Orientation: Horizontal; Conn Gender: Female; Is Female: yes; Manufacturer Part Number: HFJ11-1G01ERL; Device Class L1: Connectors; Device Class L2: Modular / Ethernet Connectors; Category: Conn; Automotive: No; ComponentLink2Description: Datasheet; Device Class L3: unset; Lead Free: Yes; Temperature Range Low: 0°C; Mouser Description: Conn RJ-45 F 8 POS 2.54mm Solder RA Thru-Hole 10 Terminal 1 Port; Temperature: 0°C to +70°C; Temperature Range High: +70°C; Package: 0; Contact Material: Gold; Height: 0.624inch; ComponentLink2URL: https://www.haloelectronics.com/pdf/fastjack-gigabit.pdf; Octopart: https://octopart.com/hfj11-1g01erl-halo-4052130; RoHS: TRUE
R89 R90 R93-R118 = CMP-009-00178-3: Chip 0402 resistor
SD1 = CMP-2000-05848-1: MicroSD(TM), Pitch 1.1 mm, 8 Position, Height 1.88 mm, -20 to 85 degC, RoHS, Tape and Reel; Manufacturer: Molex; Datasheet Version: Rev. G, 01/2012; Datasheet URL: http://www.molex.com/pdm_docs/sd/473521001_sd.pdf; Package Reference: 473521001; Manufacturer URL: http://www.molex.com/; Mounting Technology: SurfaceMount; Package Description: MicroSD(TM), Pitch 1.1 mm, 8 Position, Height 1.88 mm
Y1 = ABMM-25.000MHZ-B2-T: Crystal or Oscillator; Manufacturer_Name: ABRACON; Datasheet Link: https://abracon.com/Resonators/ABMM.pdf; Height: 1.2mm; Manufacturer_Part_Number: ABMM-25.000MHZ-B2-T; Mouser Part Number: 815-ABMM-25-B2-T; Mouser Price/Stock: https://www.mouser.co.uk/ProductDetail/ABRACON/ABMM-25.000MHZ-B2-T?qs=aMAwYrhw3fjtGmDmGUYkhw%3D%3D; Arrow Part Number: ABMM-25.000MHZ-B2-T; Arrow Price/Stock: https://www.arrow.com/en/products/abmm-25.000mhz-b2-t/abracon?utm_currency=USD&region=nac

## Sheet Audio_Codec.SchDoc
size A4; SheetNumber: 4; SheetTotal: 13
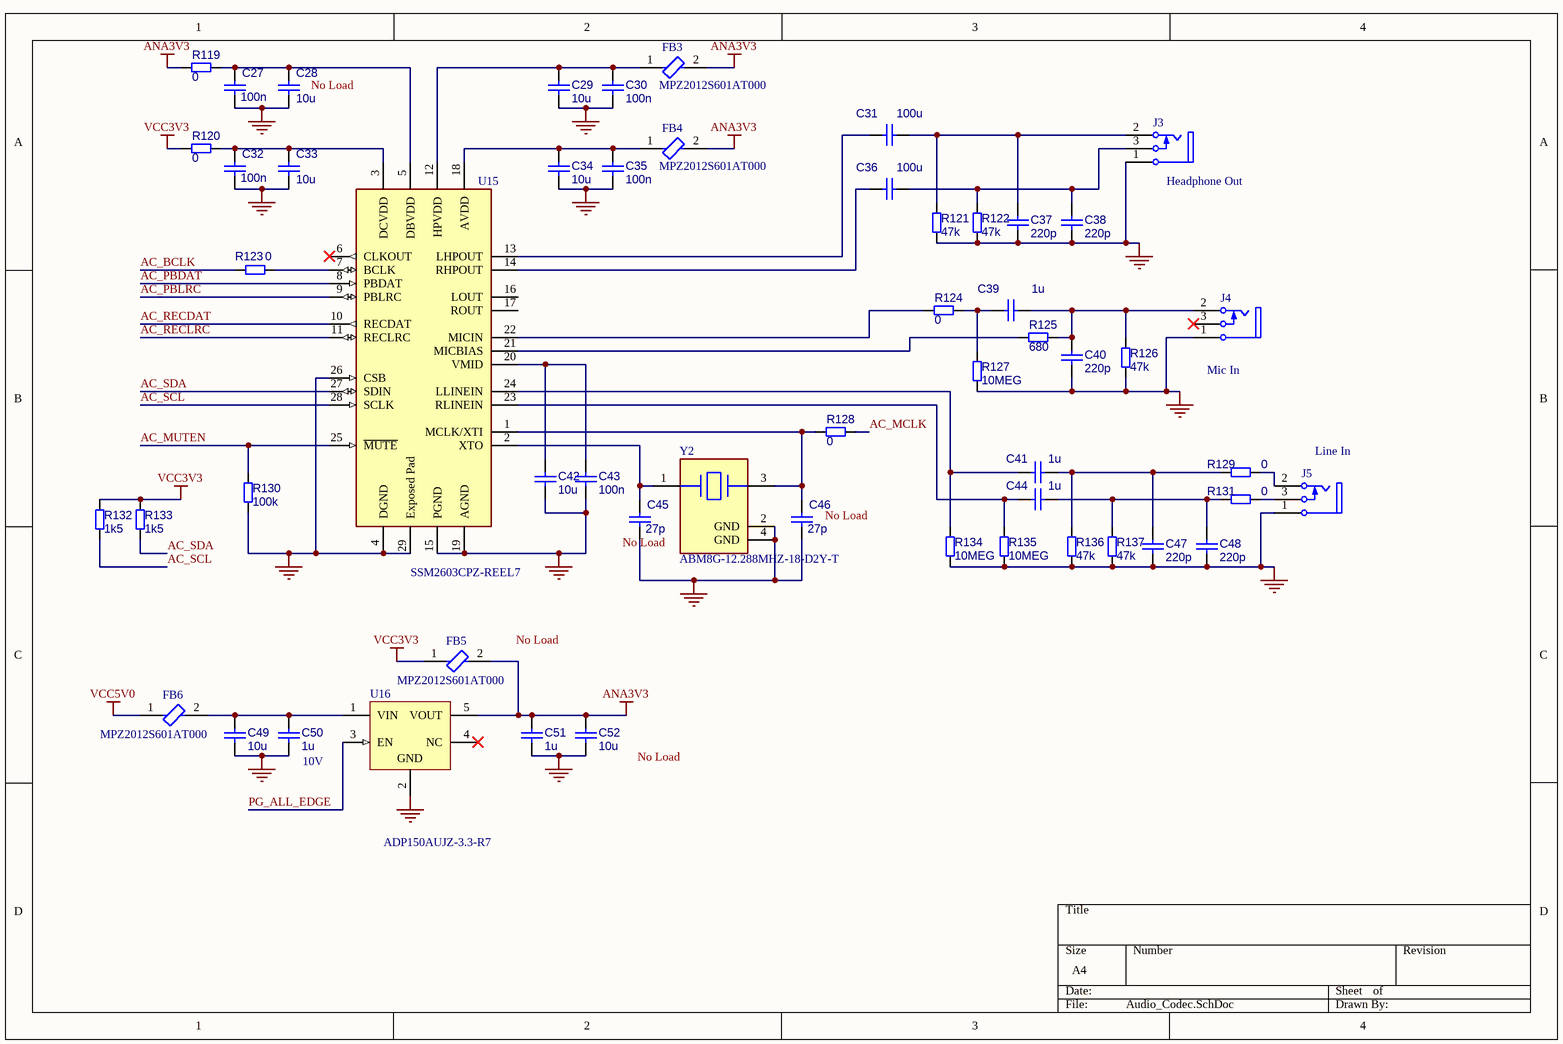
[diagram p3: Audio_Codec.SchDoc]

### Parts
C27  100n  [CAPC1005X50N_0402]
C28  10u  [C_0805]
C29  10u  [C_0805]
C30  100n  [CAPC1005X50N_0402]
C31  100u  [C_1210]
C32  100n  [CAPC1005X50N_0402]
C33  10u  [C_0805]
C34  10u  [C_0805]
C35  100n  [CAPC1005X50N_0402]
C36  100u  [C_1210]
C37  220p  [CAPC1005X50N_0402]
C38  220p  [CAPC1005X50N_0402]
C39  1u  [C_0402]
C40  220p  [CAPC1005X50N_0402]
C41  1u  [C_0402]
C42  10u  [C_0805]
C43  100n  [CAPC1005X50N_0402]
C44  1u  [C_0402]
C45  27p  [CAPC1005X50N_0402]
C46  27p  [CAPC1005X50N_0402]
C47  220p  [CAPC1005X50N_0402]
C48  220p  [CAPC1005X50N_0402]
C49  10u  [C_0805]
C50  1u  [CAPC1005X50N_0402]
C51  1u  [CAPC1005X50N_0402]
C52  10u  [C_0805]
FB3  MPZ2012S601AT000  [FP-MPZ2012-MFG]
FB4  MPZ2012S601AT000  [FP-MPZ2012-MFG]
FB5  MPZ2012S601AT000  [FP-MPZ2012-MFG]
FB6  MPZ2012S601AT000  [FP-MPZ2012-MFG]
J3  PJRAN1X1U01X  [SWIT-PJRAN1X1U01X_V]  (value not drawn)
J4  PJRAN1X1U01X  [SWIT-PJRAN1X1U01X_V]  (value not drawn)
J5  PJRAN1X1U01X  [SWIT-PJRAN1X1U01X_V]  (value not drawn)
R119  0  [R_0402]
R120  0  [R_0402]
R121  47k  [R_0402]
R122  47k  [R_0402]
R123  0  [R_0402]
R124  0  [R_0402]
R125  680  [R_0402]
R126  47k  [R_0402]
R127  10MEG  [R_0402]
R128  0  [R_0402]
R129  0  [R_0402]
R130  100k  [R_0402]
R131  0  [R_0402]
R132  1k5  [R_0402]
R133  1k5  [R_0402]
R134  10MEG  [R_0402]
R135  10MEG  [R_0402]
R136  47k  [R_0402]
R137  47k  [R_0402]
U15  SSM2603CPZ-REEL7  [FP-CP-28-10-IPC_C]
U16  ADP150AUJZ-3.3-R7  [ADI-UJ-5_M]
Y2  ABM8G-12.288MHZ-18-D2Y-T  [FP-ABM8G-MFG]

### Nets
ANA3V3: C51.2 C52.2 FB3.2 FB4.2 FB5.2 R119.2 U16.5(VOUT)
GND: C27.1 C28.1 C29.1 C30.1 C32.1 C33.1 C34.1 C35.1 C37.1 C38.1 C40.1 C42.1 C43.1 C45.1 C46.1 C47.1 C48.1 C49.1 C50.1 C51.1 C52.1 J3.1(SLEEVE) J4.1(SLEEVE) J5.1(SLEEVE) R121.2 R122.2 R126.2 R127.2 R130.2 R134.2 R135.2 R136.2 R137.2 U15.4(DGND) U15.15(PGND) U15.19(AGND) U15.26(CSB) U15.29(Exposed_Pad) U16.2(GND) Y2.2(GND) Y2.4(GND)
VCC3V3: FB5.1 R120.2 R132.1 R133.1
VCC5V0: FB6.1
AC_BCLK: R123.1
AC_MCLK: R128.1
AC_MUTEN: R130.1 U15.25(~{MUTE})
AC_PBDAT: U15.8(PBDAT)
AC_PBLRC: U15.9(PBLRC)
AC_RECDAT: U15.10(RECDAT)
AC_RECLRC: U15.11(RECLRC)
AC_SCL: R132.2 U15.28(SCLK)
AC_SDA: R133.2 U15.27(SDIN)
PG_ALL_EDGE: U16.3(EN)
NetC27_2: C27.2 C28.2 R119.1 U15.5(DBVDD)
NetC29_2: C29.2 C30.2 FB3.1 U15.12(HPVDD)
NetC31_1: C31.1 U15.13(LHPOUT)
NetC31_2: C31.2 C37.2 J3.2(TIP) R121.1
NetC32_2: C32.2 C33.2 R120.1 U15.3(DCVDD)
NetC34_2: C34.2 C35.2 FB4.1 U15.18(AVDD)
NetC36_1: C36.1 U15.14(RHPOUT)
NetC36_2: C36.2 C38.2 J3.3(SHUNT) R122.1
NetC39_1: C39.1 R124.1 R127.1
NetC39_2: C39.2 C40.2 J4.2(TIP) R125.1 R126.1
NetC41_1: C41.1 R134.1 U15.24(LLINEIN)
NetC41_2: C41.2 C47.2 R129.2 R136.1
NetC42_2: C42.2 C43.2 U15.20(VMID)
NetC44_1: C44.1 R135.1 U15.23(RLINEIN)
NetC44_2: C44.2 C48.2 R131.2 R137.1
NetC45_2: C45.2 U15.2(XTO) Y2.1
NetC46_2: C46.2 R128.2 U15.1(MCLK/XTI) Y2.3
NetC49_2: C49.2 C50.2 FB6.2 U16.1(VIN)
NetJ5_2: J5.2(TIP) R129.1
NetJ5_3: J5.3(SHUNT) R131.1
NetR123_2: R123.2 U15.7(BCLK)
NetR124_2: R124.2 U15.22(MICIN)
NetR125_2: R125.2 U15.21(MICBIAS)

Not connected (* = marked no-connect by the designer): J4 3(SHUNT)*; U15 6(CLKOUT)* 16(LOUT) 17(ROUT); U16 4(NC)*

### Notes on the sheet
- (near C28) No Load
- (near J3) Headphone Out
- (near J4) Mic In
- (near J5) Line In
- (near C46) No Load
- No Load
- (near FB5) No Load
- (near C50) 10V
- (near C52) No Load

### Library data of the parts
C27 C30 C32 C35 C37 C38 C40 C43 C45-C48 C50 C51 = CMP-001-00084-2: MLCC 0402
C28 C29 C33 C34 C42 C49 C52 = CMP-001-00086-2: MLCC 0805
C31 C36 = CMP-001-00088-1: 1210, X5R:EIA, 100uF, DC6.3V, GRM32ER60J107ME20
C39 C41 C44 = CMP-001-00085-2: MLCC 0603
FB3-FB6 = CMP-2000-05401-2: Manufacturer Lifecycle Status: PRODUCTION; NexarPartId: 12090955; RMS Current (Irms): 2A; Test Frequency: 100MHz; Tolerance: 25%; Core Material: Ferrite; Series Resistance: 100mΩ; Impedance: 600Ω; Packaging: Digi-Reel®; Length: 2mm; Min Operating Temperature: -55°C; Width: 1.25mm; Max Width: 1.45mm; Lead Free: Lead Free; Current Rating: 2A; Case Code (Imperial): 0805; Min Length: 1.8mm; Schedule B: 8504500000, 8504500000; REACH SVHC: No SVHC; Case Code (Metric): 2012; Max DC Current: 2A; Case/Package: 0805; Lifecycle Status: Production; Min Width: 1.05mm; Mount: Surface Mount; Height: 1.0414mm; Resistance: 100mΩ; DC Resistance (DCR): 100mΩ; Max Operating Temperature: 125°C; Max Length: 2.2mm; RoHS: Compliant
J3-J5 = CMP-1772-00003-1: Female Phono Jack, 3 Position, Height 13 mm, Tail Length 4 mm, RoHS, Bulk; Case\Package: Radial; Type (Capacitors): X7R; Tolerance: 10%; Voltage Rating (DC): 50 V; Capacitance: 100 nF; Package Quantity: 500; Mount: Through Hole; Packaging: Bulk; Height: 3.18 mm; Min Operating Temperature: -55 degC; Radiation Hardening: No; PackageDescription: Female Phono Jack, 3 Position, Height 13 mm, Tail Length 4 mm; Length: 6.6 mm; Lead Pitch: 2.54 mm; Width: 5.08 mm; REACH SVHC: No SVHC; ComponentLink1Description: Manufacturer URL; Max Operating Temperature: 125 degC; ComponentLink2Description: Datasheet; DatasheetVersion: Rev. A, 01/2006; Voltage Rating: 50 V; ComponentLink2URL: http://www.conxall.com/Drawings/pjran1x1u__x_series_cd.pdf; ComponentLink1URL: http://www.switchcraft.com/; RoHSCompliant: true; Pins: 2; PackageReference: PJRAN1X1U01X
R119-R137 = CMP-009-00178-3: Chip 0402 resistor
U15 = CMP-020-00026-1: Tape & Reel (TR) EAR99 Active Matte Tin (Sn) codec 90dB 1.5V 5mm 96ksps; Max Supply Voltage: 3.6V; Interface: SPI; Case/Package: LFCSP EP; Max Operating Temperature: 85°C; Min Operating Temperature: -40°C; Min Supply Voltage: 1.5V; Pins: 28; Mounting Technology: Surface Mount
U16 = CMP-0786-00394-1: Ultralow Noise, 150 mA CMOS Linear Regulator, 2.2 to 5.5 V Vin, 3.3 V Vout, Industrial, 5-pin SOT23 (UJ-5), Reel; Manufacturer: Analog Devices; Supply Current IGND @ Small Load: 10uA; Vin (min) (V): 2.2; Iout max: 150mA; Preset Vout Values (V): 3.3; Vin (max) (V): 5.5; ComponentLink2Description: Datasheet; PackageReference: UJ-5; DatasheetVersion: Rev. A; PackageDescription: 5-Pin Thin Small Outline Transistor Package, Body 2.9 x 1.6 mm, Pitch 0.95 mm; ComponentLink4URL: Product URL:http://www.analog.com/en/ADP150/productSearch.html; Packing: Reel; ComponentLink1URL: http://www.analog.com/en/index.html; PartNumber: ADP150AUJZ-3.3-R7; PackageVersion: 100708-A, 10/2008; ComponentLink3Description: Package Specification; ComponentLink3URL: http:/www.analog.com/static/imported-files/packages/PKG_PDF/TSOT(UJ)/UJ_5.pdf; ComponentLink4Description: URL Link1; ComponentLink2URL: http://www.analog.com/static/imported-files/data_sheets/ADP150.pdf; Code_JEDEC: MO-193-AB; Mounting Technology: Surface Mount; ComponentLink1Description: Manufacturer URL
Y2 = CMP-27762-015475-1: Crystal 12.288MHz ±20ppm (Tol) ±30ppm (Stability) 18pF FUND 80Ω 4-Pin SMD T/R; Series Resistance: 80R; Packaging: Tape and Reel; Operating Frequency: 12.288 MHz; Load Capacitance: 18pF; Frequency Stability: 30ppm; Package Quantity: 1000; Length: 3.2mm; Lead Free: Lead Free; Termination: SMD/SMT; REACH SVHC: Yes; Number of Pins: 4; Tolerance: 20ppm; Width: 0.098inch; Mount: Surface Mount; Depth: 2.5mm; Series: ABM8G; Height: 0.039inch; ESR (Equivalent Series Resistance): 80R; Min Operating Temperature: -40°C; Frequency: 12.288MHz; Max Operating Temperature: 85°C; Frequency Tolerance: 20ppm; Case/Package: SMD/SMT

## Sheet HDMI_Source.SchDoc
size A4; SheetNumber: 5; SheetTotal: 13
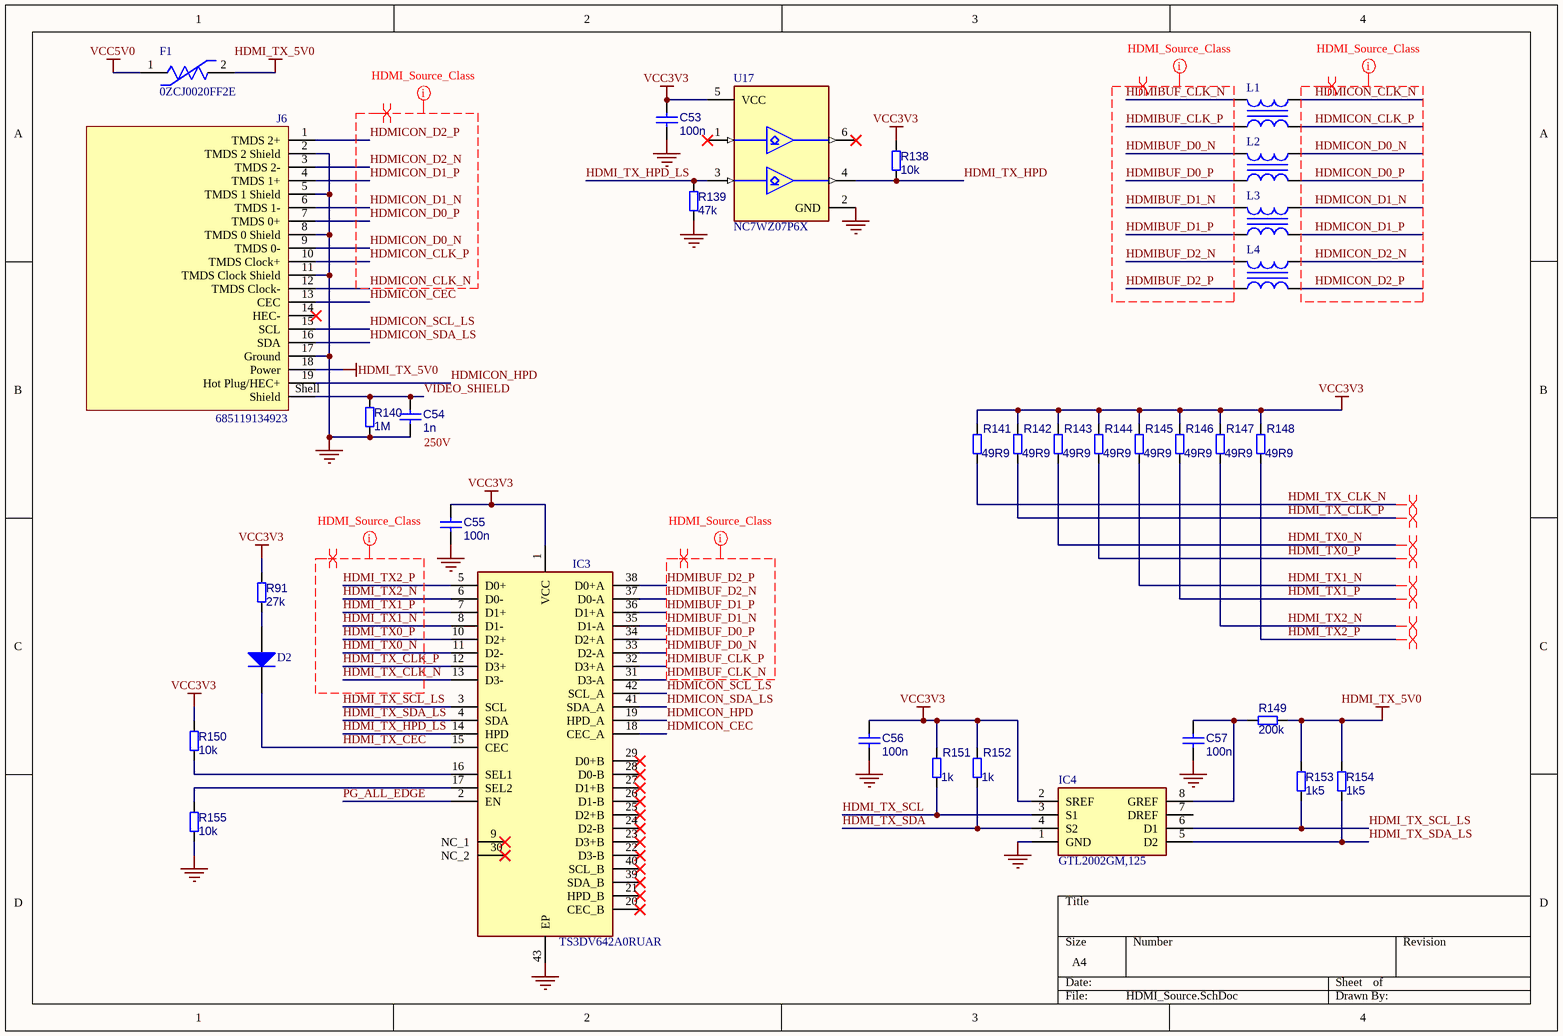
[diagram p4: HDMI_Source.SchDoc]

### Parts
C53  100n  [CAPC1005X50N_0402]
C54  1n  [CAPC1005X50N_0402]
C55  100n  [CAPC1005X50N_0402]
C56  100n  [CAPC1005X50N_0402]
C57  100n  [CAPC1005X50N_0402]
D2  BAS16XV2T1G  [ONSC-SOD-523-2-502-01_V]  (value not drawn)
F1  0ZCJ0020FF2E  [FP-0ZCJ-MFG]
IC3  TS3DV642A0RUAR  [QFN50P350X900X80-43N-D]
IC4  GTL2002GM,125  [GTL2002GM125]
J6  685119134923  [685119134923]
L1  TCM06U  [TCM06U_DFN65X50X35-4N]  (value not drawn)
L2  TCM06U  [TCM06U_DFN65X50X35-4N]  (value not drawn)
L3  TCM06U  [TCM06U_DFN65X50X35-4N]  (value not drawn)
L4  TCM06U  [TCM06U_DFN65X50X35-4N]  (value not drawn)
R91  27k  [R_0402]
R138  10k  [R_0402]
R139  47k  [R_0402]
R140  1M  [R_0402]
R141  49R9  [R_0402]
R142  49R9  [R_0402]
R143  49R9  [R_0402]
R144  49R9  [R_0402]
R145  49R9  [R_0402]
R146  49R9  [R_0402]
R147  49R9  [R_0402]
R148  49R9  [R_0402]
R149  200k  [R_0402]
R150  10k  [R_0402]
R151  1k  [R_0402]
R152  1k  [R_0402]
R153  1k5  [R_0402]
R154  1k5  [R_0402]
R155  10k  [R_0402]
U17  NC7WZ07P6X  [FP-419AD-01-MFG]

### Nets
GND: C53.1 C54.1 C55.1 C56.1 C57.1 IC3.43(EP) IC4.1(GND) J6.2(TMDS_2_Shield) J6.5(TMDS_1_Shield) J6.8(TMDS_0_Shield) J6.11(TMDS_Clock_Shield) J6.17(Ground) R139.2 R140.2 R155.2 U17.2(GND)
HDMI_TX_5V0: F1.2 J6.18(Power) R149.2 R153.1 R154.1
VCC3V3: C53.2 C55.2 C56.2 IC3.1(VCC) IC4.2(SREF) R91.1 R138.1 R141.1 R142.1 R143.1 R144.1 R145.1 R146.1 R147.1 R148.1 R150.1 R151.1 R152.1 U17.5(VCC)
VCC5V0: F1.1
HDMI_TX0_N: IC3.11(D2-) R143.2
HDMI_TX0_P: IC3.10(D2+) R144.2
HDMI_TX1_N: IC3.8(D1-) R145.2
HDMI_TX1_P: IC3.7(D1+) R146.2
HDMI_TX2_N: IC3.6(D0-) R147.2
HDMI_TX2_P: IC3.5(D0+) R148.2
HDMI_TX_CEC: D2.1(K) IC3.15(CEC)
HDMI_TX_CLK_N: IC3.13(D3-) R141.2
HDMI_TX_CLK_P: IC3.12(D3+) R142.2
HDMI_TX_HPD: R138.2 U17.4(Y2)
HDMI_TX_HPD_LS: IC3.14(HPD) R139.1 U17.3(A2)
HDMI_TX_SCL: IC4.3(S1) R151.2
HDMI_TX_SCL_LS: IC3.3(SCL) IC4.6(D1) R153.2
HDMI_TX_SDA: IC4.4(S2) R152.2
HDMI_TX_SDA_LS: IC3.4(SDA) IC4.5(D2) R154.2
HDMIBUF_CLK_N: IC3.31(D3-A) L1.4
HDMIBUF_CLK_P: IC3.32(D3+A) L1.3
HDMIBUF_D0_N: IC3.33(D2-A) L2.4
HDMIBUF_D0_P: IC3.34(D2+A) L2.3
HDMIBUF_D1_N: IC3.35(D1-A) L3.4
HDMIBUF_D1_P: IC3.36(D1+A) L3.3
HDMIBUF_D2_N: IC3.37(D0-A) L4.4
HDMIBUF_D2_P: IC3.38(D0+A) L4.3
HDMICON_CEC: IC3.18(CEC_A) J6.13(CEC)
HDMICON_CLK_N: J6.12(TMDS_Clock-) L1.1
HDMICON_CLK_P: J6.10(TMDS_Clock+) L1.2
HDMICON_D0_N: J6.9(TMDS_0-) L2.1
HDMICON_D0_P: J6.7(TMDS_0+) L2.2
HDMICON_D1_N: J6.6(TMDS_1-) L3.1
HDMICON_D1_P: J6.4(TMDS_1+) L3.2
HDMICON_D2_N: J6.3(TMDS_2-) L4.1
HDMICON_D2_P: J6.1(TMDS_2+) L4.2
HDMICON_HPD: IC3.19(HPD_A) J6.19(Hot_Plug/HEC+)
HDMICON_SCL_LS: IC3.42(SCL_A) J6.15(SCL)
HDMICON_SDA_LS: IC3.41(SDA_A) J6.16(SDA)
PG_ALL_EDGE: IC3.2(EN)
VIDEO_SHIELD: C54.2 J6.Shell(Shield) R140.1
NetC57_2: C57.2 IC4.8(GREF) R149.1
NetD2_2: D2.2(A) R91.2
NetIC3_16: IC3.16(SEL1) R150.2
NetIC3_17: IC3.17(SEL2) R155.1

Not connected (* = marked no-connect by the designer): IC3 9(NC_1)* 20(CEC_B)* 21(HPD_B)* 22(D3-B)* 23(D3+B)* 24(D2-B)* 25(D2+B)* 26(D1-B)* 27(D1+B)* 28(D0-B)* 29(D0+B)* 30(NC_2)* 39(SDA_B)* 40(SCL_B)*; IC4 7(DREF); J6 14(HEC-)*; U17 1(A1)* 6(Y1)*

### Layout directives
differential pair: HDMI_TX0_N, HDMI_TX0_P, HDMI_TX1_N, HDMI_TX1_P, HDMI_TX2_N, HDMI_TX2_P, HDMI_TX_CLK_N, HDMI_TX_CLK_P, HDMIBUF_CLK_N, HDMIBUF_CLK_P, HDMIBUF_D0_N, HDMIBUF_D0_P, HDMIBUF_D1_N, HDMIBUF_D1_P, HDMIBUF_D2_N, HDMIBUF_D2_P, HDMICON_CLK_N, HDMICON_CLK_P, HDMICON_D0_N, HDMICON_D0_P, HDMICON_D1_N, HDMICON_D1_P, HDMICON_D2_N, HDMICON_D2_P
net class HDMI_Source_Class: HDMI_TX0_N, HDMI_TX0_P, HDMI_TX1_N, HDMI_TX1_P, HDMI_TX2_N, HDMI_TX2_P, HDMI_TX_CLK_N, HDMI_TX_CLK_P, HDMIBUF_CLK_N, HDMIBUF_CLK_P, HDMIBUF_D0_N, HDMIBUF_D0_P, HDMIBUF_D1_N, HDMIBUF_D1_P, HDMIBUF_D2_N, HDMIBUF_D2_P, HDMICON_CLK_N, HDMICON_CLK_P, HDMICON_D0_N, HDMICON_D0_P, HDMICON_D1_N, HDMICON_D1_P, HDMICON_D2_N, HDMICON_D2_P

### Notes on the sheet
- (near C54) 250V

### Library data of the parts
C53-C57 = CMP-001-00084-2: MLCC 0402
D2 = CMP-1054-00076-1: as D1 on sheet Ethernet_and_SD_Card; ComponentLink1URL: http://www.onsemi.com/; DatasheetVersion: Rev. 7; RoHS: TRUE; PackageVersion: Rev. E, 09/2010; Packing: Tape and Reel; ComponentLink2Description: Datasheet; ComponentLink2URL: http://www.onsemi.com/pub_link/Collateral/BAS16XV2T1-D.PDF; ComponentLink3Description: Package Specification; PackageReference: SOD-523-2-502-01; ComponentLink1Description: Manufacturer URL; PartNumber: BAS16XV2T1G; Mounting Technology: Surface Mount; PackageDescription: 2-Pin SOD, Body 1.2 x 0.8 mm; ComponentLink3URL: http://www.onsemi.com/pub_link/Collateral/502-01.PDF
F1 = CMP-16043-000007-1: PTC RESET FUSE 30V 200MA 1206; Trip Current: 400mA; Approvals: UL; Power Dissipation: 400mW; Time to Trip: 0.1s; Max Current Rating: 10A; Case Code (Imperial): 1206; Max Voltage Rating (DC): 30V; Case Code (Metric): 3216; Min Operating Temperature: -40°C; Case/Package: 1206; Hold Current: 200mA; Package Quantity: 3000; Lead Free: Lead Free; Contact Plating: Tin; Number of Terminals: 2; Mount: Surface Mount; Max Operating Temperature: 85°C; Packaging: Cut Tape
IC3 = TS3DV642A0RUAR: Integrated Circuit; Manufacturer_Name: Texas Instruments; Datasheet Link: http://www.ti.com/lit/gpn/ts3dv642; Height: 0.8mm; Manufacturer_Part_Number: TS3DV642A0RUAR; Mouser Part Number: 595-TS3DV642A0RUAR; Mouser Price/Stock: https://www.mouser.co.uk/ProductDetail/Texas-Instruments/TS3DV642A0RUAR?qs=zjX5mX%252BjEMCTQjtLUY3z%2FA%3D%3D; Arrow Part Number: TS3DV642A0RUAR; Arrow Price/Stock: https://www.arrow.com/en/products/ts3dv642a0ruar/texas-instruments.html?utm_currency=USD&region=nac
IC4 = GTL2002GM,125: Integrated Circuit; Manufacturer_Name: NXP; Datasheet Link: https://componentsearchengine.com/Datasheets/2/GTL2002GM,125.pdf; Height: 0.5mm; Manufacturer_Part_Number: GTL2002GM,125; Mouser Part Number: 771-GTL2002GM125; Mouser Price/Stock: https://www.mouser.co.uk/ProductDetail/NXP-Semiconductors/GTL2002GM125?qs=me8TqzrmIYUIuvCVdWJDlA%3D%3D
J6 = CMP-1502-00169-4: HDMI Receptacle Connector 19 Position Surface Mount, Right Angle Through Hole; Contact Resistance: 30mΩ; Number of Contacts: 19; Current Rating: 500mA; Body Material: Plastic; Voltage Rating: 40V; Insulation Resistance: 10MΩ; Mount: Horizontal, Surface Mount; Connector Type: HDMI; Height: 6.28mm; Width: 15mm; Contact Material: Gold; Termination: SMD/SMT; Orientation: Horizontal; Min Operating Temperature: -25°C; RoHS: Compliant; Number of Pins: 19; REACH SVHC: Unknown; Features: Shielded; Packaging: Tape and Reel; Gender: Receptacle; Number of Positions: 19; Max Operating Temperature: 85°C; Length: 12.15mm; Color: Black
L1-L4 = CMP-006-00021-1: Common mode filters Ultra high-speed differential signal line TCM-U series
R91 R138-R155 = CMP-009-00178-3: Chip 0402 resistor
U17 = CMP-2000-06822-2: IC BUF NON-INVERT 5.5V SC70-6; Propagation Delay: 12.6ns; Max Power Dissipation: 180mW; High Level Output Current: 32mA; Number of Outputs: 2; Number of Bits per Element: 1; Polarity: Non-Inverting; Max Supply Current: 24mA; Turn-On Delay Time: 11.5ns; Logic Function: Buffer; Min Supply Voltage: 1.65V; Quiescent Current: 1uA; REACH SVHC: No SVHC; Lead Free: Lead Free; Packaging: Tape and Reel; Low Level Output Current: 32mA; Number of Channels: 2; Number of Output Lines: 2; Number of Bits: 2; Min Operating Temperature: -40°C; Radiation Hardening: No; Number of Elements: 2; Number of Pins: 6; Number of Inputs: 2; Max Supply Voltage: 5.5V; Package Quantity: 1; Termination: SMD/SMT; Number of Input Lines: 2; Number of Circuits: 2; Weight: 0.028g; Max Operating Temperature: 85°C; Case/Package: SC; Length: 2mm; Width: 1.25mm; Mount: Surface Mount; Height: 1mm

## Sheet HDMI_Sink.SchDoc
size A4; SheetNumber: 6; SheetTotal: 13
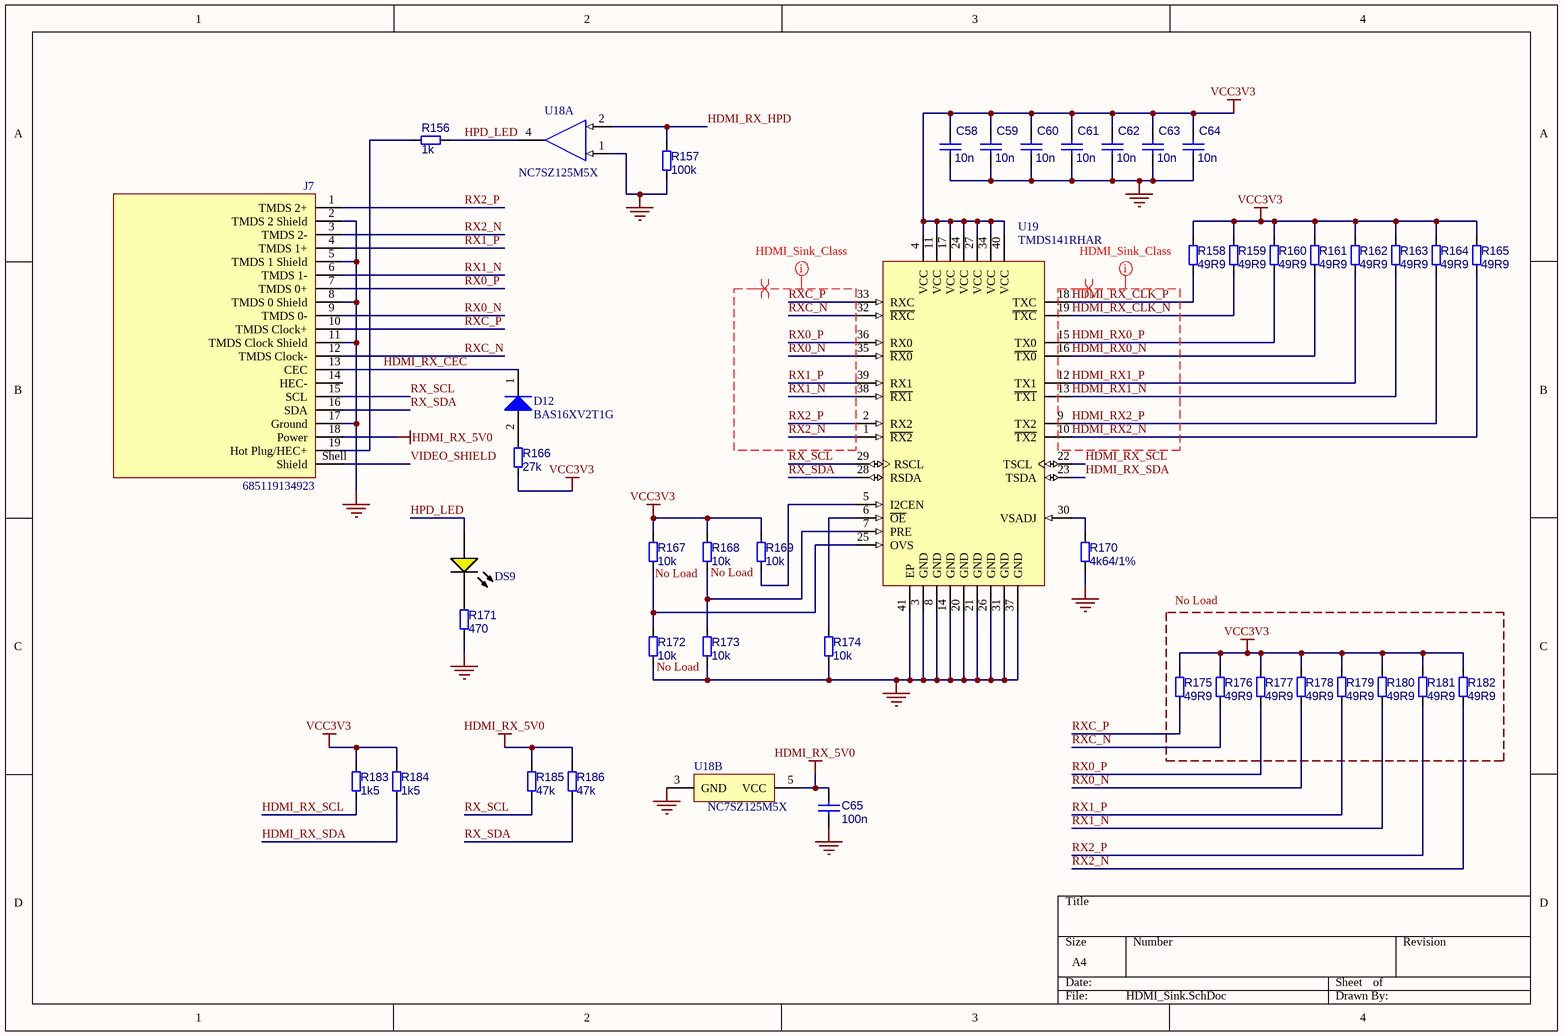
[diagram p5: HDMI_Sink.SchDoc]

### Parts
C58  10n  [CAPC1005X50N_0402]
C59  10n  [CAPC1005X50N_0402]
C60  10n  [CAPC1005X50N_0402]
C61  10n  [CAPC1005X50N_0402]
C62  10n  [CAPC1005X50N_0402]
C63  10n  [CAPC1005X50N_0402]
C64  10n  [CAPC1005X50N_0402]
C65  100n  [CAPC1005X50N_0402]
D12  BAS16XV2T1G  [ONSC-SOD-523-2-502-01_V]
DS9  19-217/Y5C-AM1N1VY/3T  [EVRL-0603-2_V]  (value not drawn)
J7  685119134923  [685119134923]
R156  1k  [R_0402]
R157  100k  [R_0402]
R158  49R9  [R_0402]
R159  49R9  [R_0402]
R160  49R9  [R_0402]
R161  49R9  [R_0402]
R162  49R9  [R_0402]
R163  49R9  [R_0402]
R164  49R9  [R_0402]
R165  49R9  [R_0402]
R166  27k  [R_0402]
R167  10k  [R_0402]
R168  10k  [R_0402]
R169  10k  [R_0402]
R170  4k64/1%  [R_0402]
R171  470  [R_0402]
R172  10k  [R_0402]
R173  10k  [R_0402]
R174  10k  [R_0402]
R175  49R9  [R_0402]
R176  49R9  [R_0402]
R177  49R9  [R_0402]
R178  49R9  [R_0402]
R179  49R9  [R_0402]
R180  49R9  [R_0402]
R181  49R9  [R_0402]
R182  49R9  [R_0402]
R183  1k5  [R_0402]
R184  1k5  [R_0402]
R185  47k  [R_0402]
R186  47k  [R_0402]
U18  NC7SZ125M5X  [FAIR-SOT23-5_V]  (parts A,B of 2)
U19  TMDS141RHAR  [RHA0040D_V]

### Blocks framed on the sheet
No Load: R175-R182

### Nets
GND: C58.1 C59.1 C60.1 C61.1 C62.1 C63.1 C64.1 C65.1 J7.2(TMDS_2_Shield) J7.5(TMDS_1_Shield) J7.8(TMDS_0_Shield) J7.11(TMDS_Clock_Shield) J7.17(Ground) R157.1 R170.1 R171.1 R172.1 R173.1 R174.1 U18.1(~{OE}) U18.3(GND) U19.3(GND) U19.8(GND) U19.14(GND) U19.20(GND) U19.21(GND) U19.26(GND) U19.31(GND) U19.37(GND) U19.41(EP)
HDMI_RX_5V0: C65.2 J7.18(Power) R185.2 R186.2 U18.5(VCC)
VCC3V3: C58.2 C59.2 C60.2 C61.2 C62.2 C63.2 C64.2 R158.2 R159.2 R160.2 R161.2 R162.2 R163.2 R164.2 R165.2 R166.1 R167.2 R168.2 R169.2 R175.2 R176.2 R177.2 R178.2 R179.2 R180.2 R181.2 R182.2 R183.2 R184.2 U19.4(VCC) U19.11(VCC) U19.17(VCC) U19.24(VCC) U19.27(VCC) U19.34(VCC) U19.40(VCC)
HDMI_RX0_N: R161.1 U19.16(~{TX0})
HDMI_RX0_P: R160.1 U19.15(TX0)
HDMI_RX1_N: R163.1 U19.13(~{TX1})
HDMI_RX1_P: R162.1 U19.12(TX1)
HDMI_RX2_N: R165.1 U19.10(~{TX2})
HDMI_RX2_P: R164.1 U19.9(TX2)
HDMI_RX_CEC: D12.1(K) J7.13(CEC)
HDMI_RX_CLK_N: R159.1 U19.19(~{TXC})
HDMI_RX_CLK_P: R158.1 U19.18(TXC)
HDMI_RX_HPD: R157.2 U18.2(A)
HDMI_RX_SCL: R183.1 U19.22(TSCL)
HDMI_RX_SDA: R184.1 U19.23(TSDA)
HPD_LED: DS9.1(A) R156.2 U18.4(Y)
RX0_N: J7.9(TMDS_0-) R178.1 U19.35(~{RX0})
RX0_P: J7.7(TMDS_0+) R177.1 U19.36(RX0)
RX1_N: J7.6(TMDS_1-) R180.1 U19.38(~{RX1})
RX1_P: J7.4(TMDS_1+) R179.1 U19.39(RX1)
RX2_N: J7.3(TMDS_2-) R182.1 U19.1(~{RX2})
RX2_P: J7.1(TMDS_2+) R181.1 U19.2(RX2)
RX_SCL: J7.15(SCL) R185.1 U19.29(RSCL)
RX_SDA: J7.16(SDA) R186.1 U19.28(RSDA)
RXC_N: J7.12(TMDS_Clock-) R176.1 U19.32(~{RXC})
RXC_P: J7.10(TMDS_Clock+) R175.1 U19.33(RXC)
VIDEO_SHIELD: J7.Shell(Shield)
NetD12_2: D12.2(A) R166.2
NetDS9_2: DS9.2(K) R171.2
NetJ7_19: J7.19(Hot_Plug/HEC+) R156.1
NetR167_1: R167.1 R172.2 U19.25(OVS)
NetR168_1: R168.1 R173.2 U19.7(PRE)
NetR169_1: R169.1 U19.5(I2CEN)
NetR170_2: R170.2 U19.30(VSADJ)
NetR174_2: R174.2 U19.6(~{OE})

Not connected (* = marked no-connect by the designer): J7 14(HEC-)

### Layout directives
net class HDMI_Sink_Class: HDMI_RX0_N, HDMI_RX0_P, HDMI_RX1_N, HDMI_RX1_P, HDMI_RX2_N, HDMI_RX2_P, HDMI_RX_CLK_N, HDMI_RX_CLK_P, RX0_N, RX0_P, RX1_N, RX1_P, RX2_N, RX2_P, RXC_N, RXC_P
differential pair: HDMI_RX0_N, HDMI_RX0_P, HDMI_RX1_N, HDMI_RX1_P, HDMI_RX2_N, HDMI_RX2_P, HDMI_RX_CLK_N, HDMI_RX_CLK_P, RX0_N, RX0_P, RX1_N, RX1_P, RX2_N, RX2_P, RXC_N, RXC_P

### Notes on the sheet
- No Load

### Library data of the parts
C58-C65 = CMP-001-00084-2: MLCC 0402
D12 = CMP-1054-00076-1: as D1 on sheet Ethernet_and_SD_Card; ComponentLink1URL: http://www.onsemi.com/; DatasheetVersion: Rev. 7; RoHS: TRUE; PackageVersion: Rev. E, 09/2010; Packing: Tape and Reel; ComponentLink2Description: Datasheet; ComponentLink2URL: http://www.onsemi.com/pub_link/Collateral/BAS16XV2T1-D.PDF; ComponentLink3Description: Package Specification; PackageReference: SOD-523-2-502-01; ComponentLink1Description: Manufacturer URL; PartNumber: BAS16XV2T1G; Mounting Technology: Surface Mount; PackageDescription: 2-Pin SOD, Body 1.2 x 0.8 mm; ComponentLink3URL: http://www.onsemi.com/pub_link/Collateral/502-01.PDF
DS9 = CMP-007-00005-2: as DS1 on sheet PMODs_MIO; Datasheet Version: Rev. 1.0, 12/2005; Package Reference: 0603; Mounting Technology: SM; Package Description: 2-Pin Surface Mount Device, Body 1.6 x 0.8 mm; Case/Package: 0603; Datasheet URL: http://www.fairchip.com/pdf/Everlight/19-217-Y5C-AM1N1VY-3T.pdf; Manufacturer URL: http://www.everlight.com/; RoHS Compliant: False
J7 = CMP-1502-00169-4: as J6 on sheet HDMI_Source; Mount: Horizontal, Surface Mount; Connector Type: HDMI; Height: 6.28mm; Width: 15mm; Contact Material: Gold; Termination: SMD/SMT; Orientation: Horizontal; Min Operating Temperature: -25°C; RoHS: Compliant; Number of Pins: 19; REACH SVHC: Unknown; Features: Shielded; Packaging: Tape and Reel; Gender: Receptacle; Number of Positions: 19; Max Operating Temperature: 85°C; Length: 12.15mm; Color: Black
R156-R186 = CMP-009-00178-3: Chip 0402 resistor
U18 = CMP-2000-06816-1: TinyLogic UHS Buffer with Three-State Output, 1.65 to 5.5 V, -40 to 85 degC, 5-Pin SOT23, RoHS, Tape and Reel; Manufacturer: Fairchild Semiconductor; Input Signal Type: Single-Ended; Maximum Operating Supply Voltage: 5.5V; Number of Outputs per Chip: 1; Maximum Propagation Delay Time @ Maximum CL: 5.7@3.3V; Minimum Operating Supply Voltage: 1.65V; Maximum Quiescent Current: 2uA; Propagation Delay Test Condition: 50pF; Lead Finish: MatteTin; Number of Output Enables per Chip: 1Low; Maximum Low Level Output Current: 32mA; Output Type: 3-State; Package Version: 08/2015; Max Processing Temp: 260; Maximum High Level Output Current: -32mA; Tolerant I/Os: 5V; Bus Hold: No; Fabrication Technology: CMOS; Polarity: Non-Inverting; Typical Operating Supply Voltage: 1.8; Logic Function: Buffer/LineDriver; Manufacturer URL: https://www.fairchildsemi.com/; Mounting: SurfaceMount; Number of Channels per Chip: 1; Package Description: 5-Pin Small Outline Transistor, Body 2.9 x 1.6 mm, Pitch 0.95 mm; Package Reference: SOT23-5; Number of Elements per Chip: 1; Package URL: https://www.fairchildsemi.com/package-drawings/MA/MA05B.pdf; Datasheet URL: https://www.fairchildsemi.com/datasheets/NC/NC7SZ125.pdf; Datasheet Version: Rev. 1.0.5, 01/2014; Mounting Technology: SurfaceMount; Operating Temperature: -40to85C; Number of Inputs per Chip: 1
U19 = CMP-020-00027-1: 2.25-Gbps HDMI 1.3a TMDS redriver 40-VQFN 0 to 70; Min Supply Voltage: 3V; Max Supply Voltage: 3.6V; Max Operating Temperature: 70°C; Pins: 40; Case/Package: VQFN; Min Operating Temperature: 0°C